# EasyEDA Pro project H7MS-native-wired-before-footprint-audit-20261017.epro

# Schematic H7MS_CORE_H735_A1_核心板原理图

## Sheets
1 C01A_H735主控与信号分配: Assembly Variant: Basic; Board Name: Board1; Create Date: 2026-08-30; Page Name: P1; Project Name: H7MS-Core-A1; Schematic Name: Schematic1; Update Date: 2026-08-30; Company: 嘉立创EDA; Page Size: A4; Version: V1.0
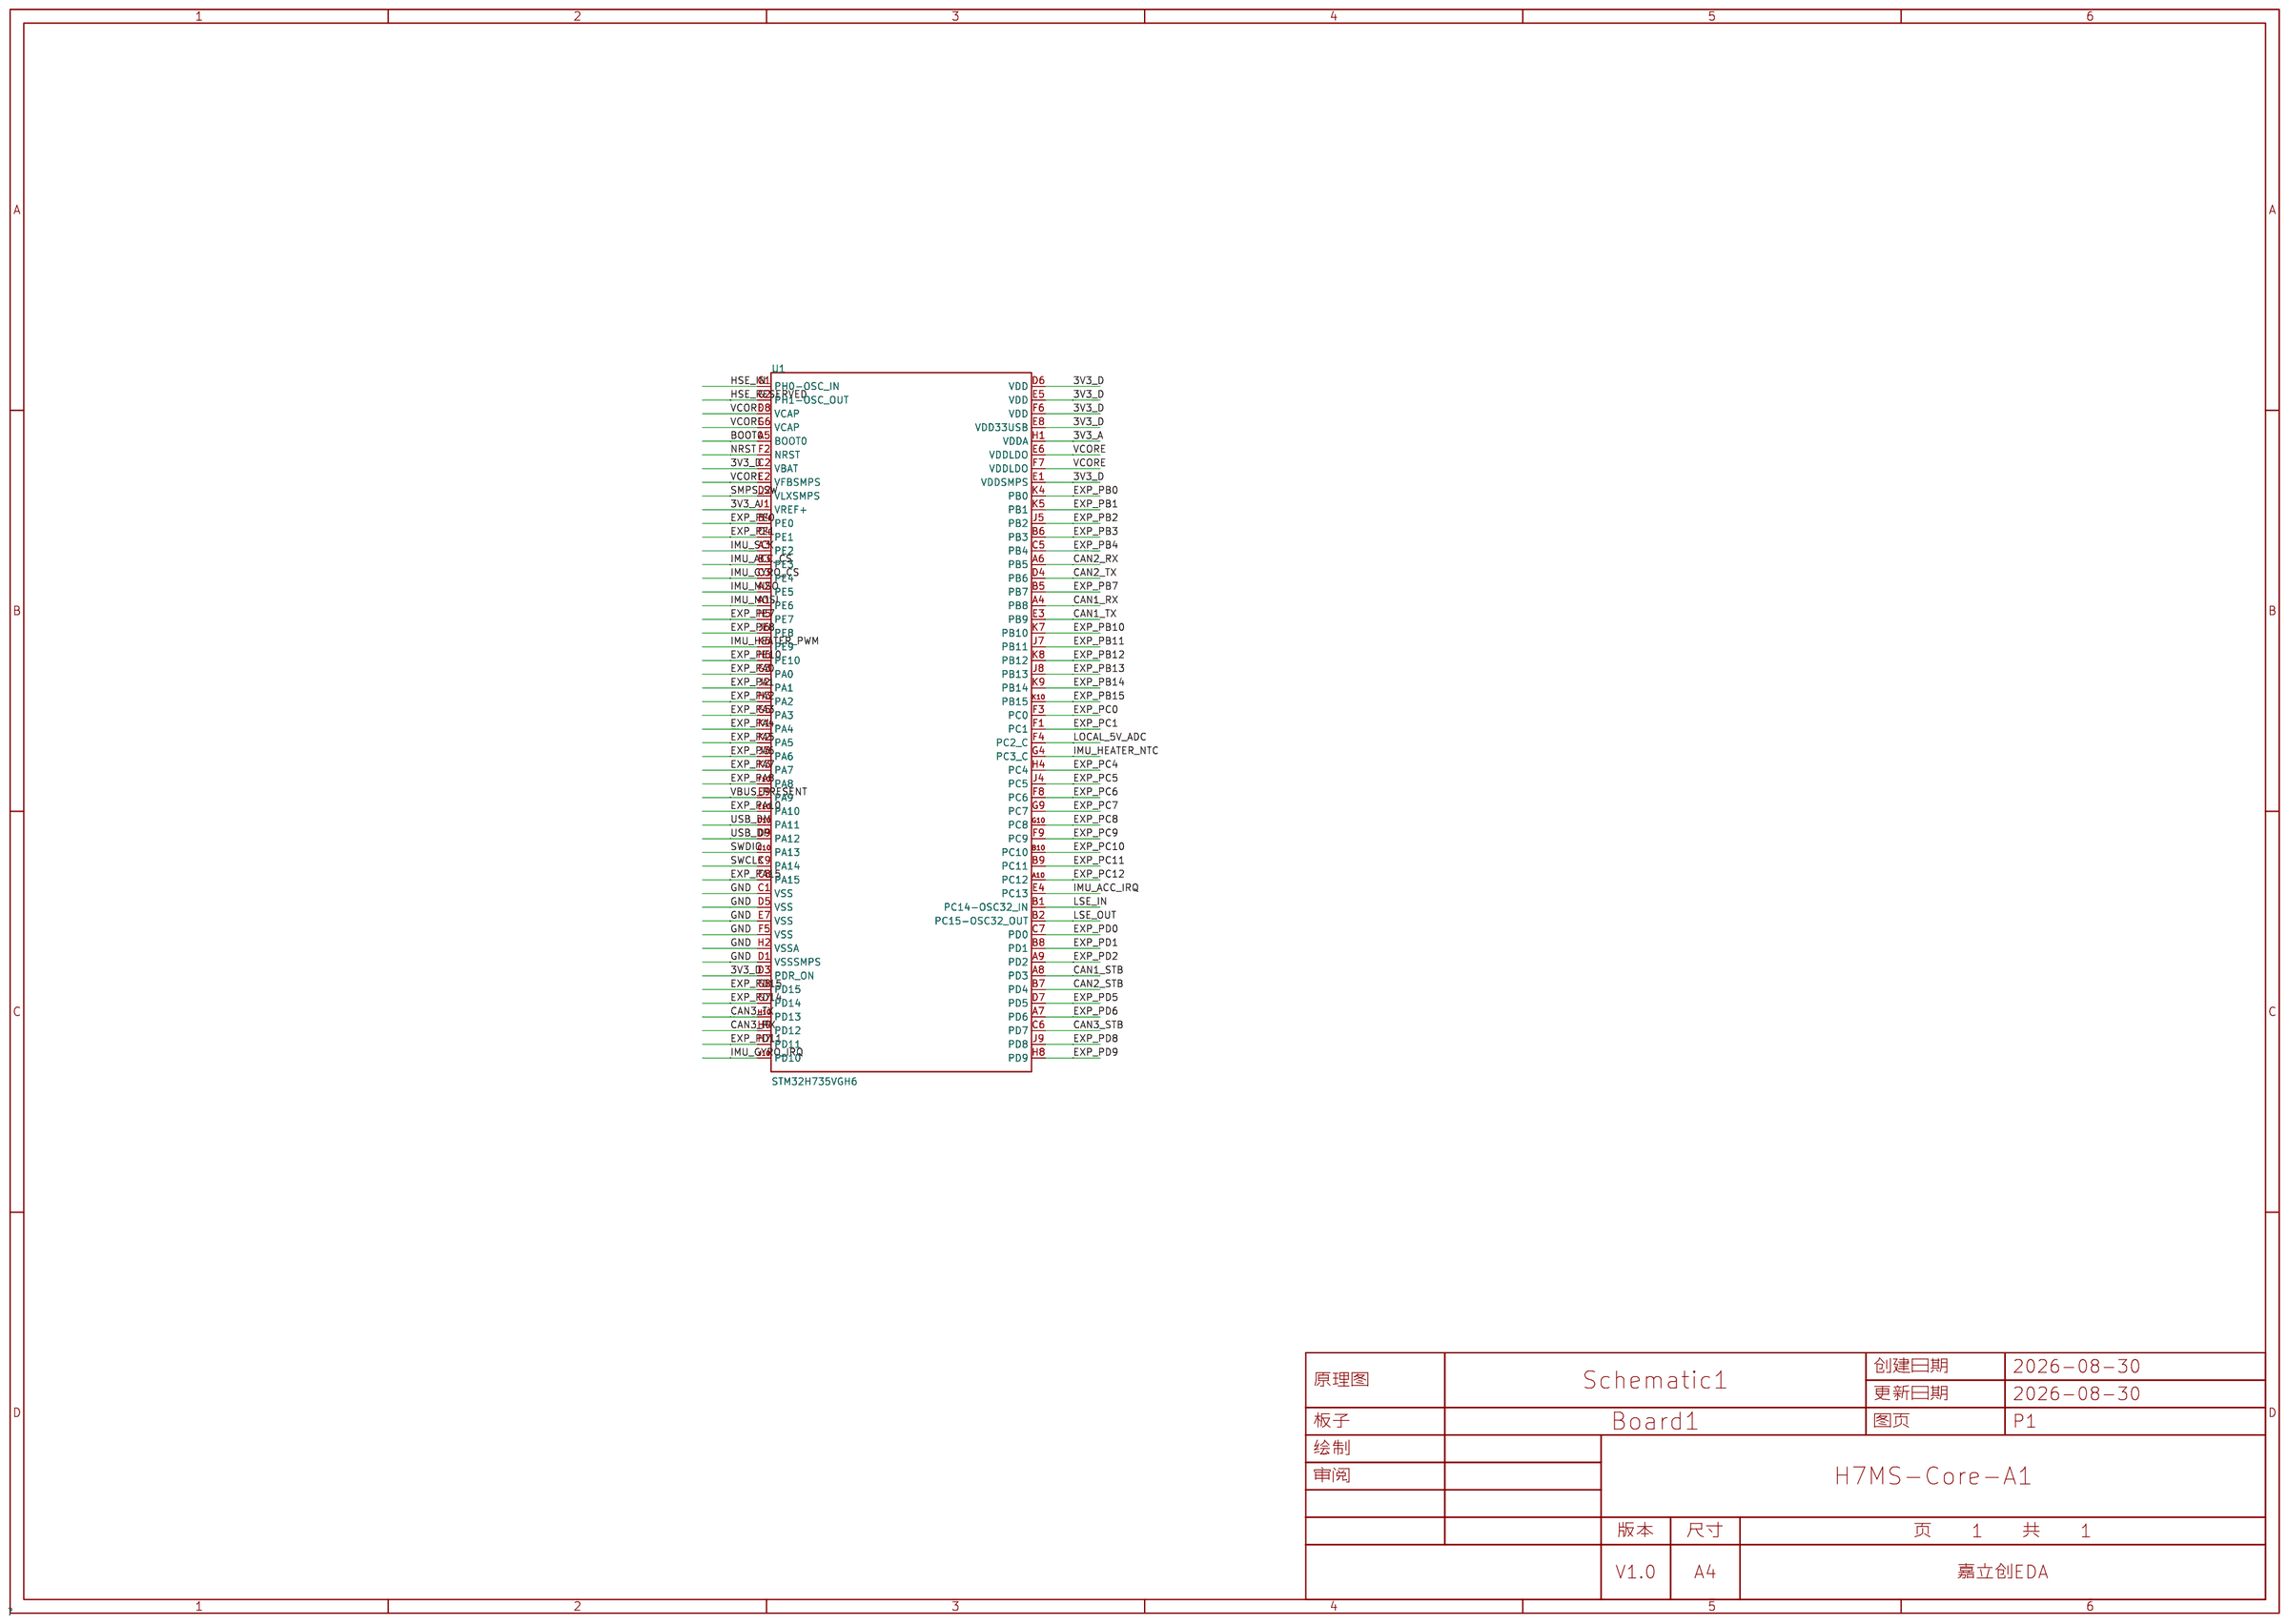
[diagram p0: C01A_H735主控与信号分配]
2 C01B_主控SMPS与电源去耦: Create Date: 2026-10-17; Update Date: 2026-10-17
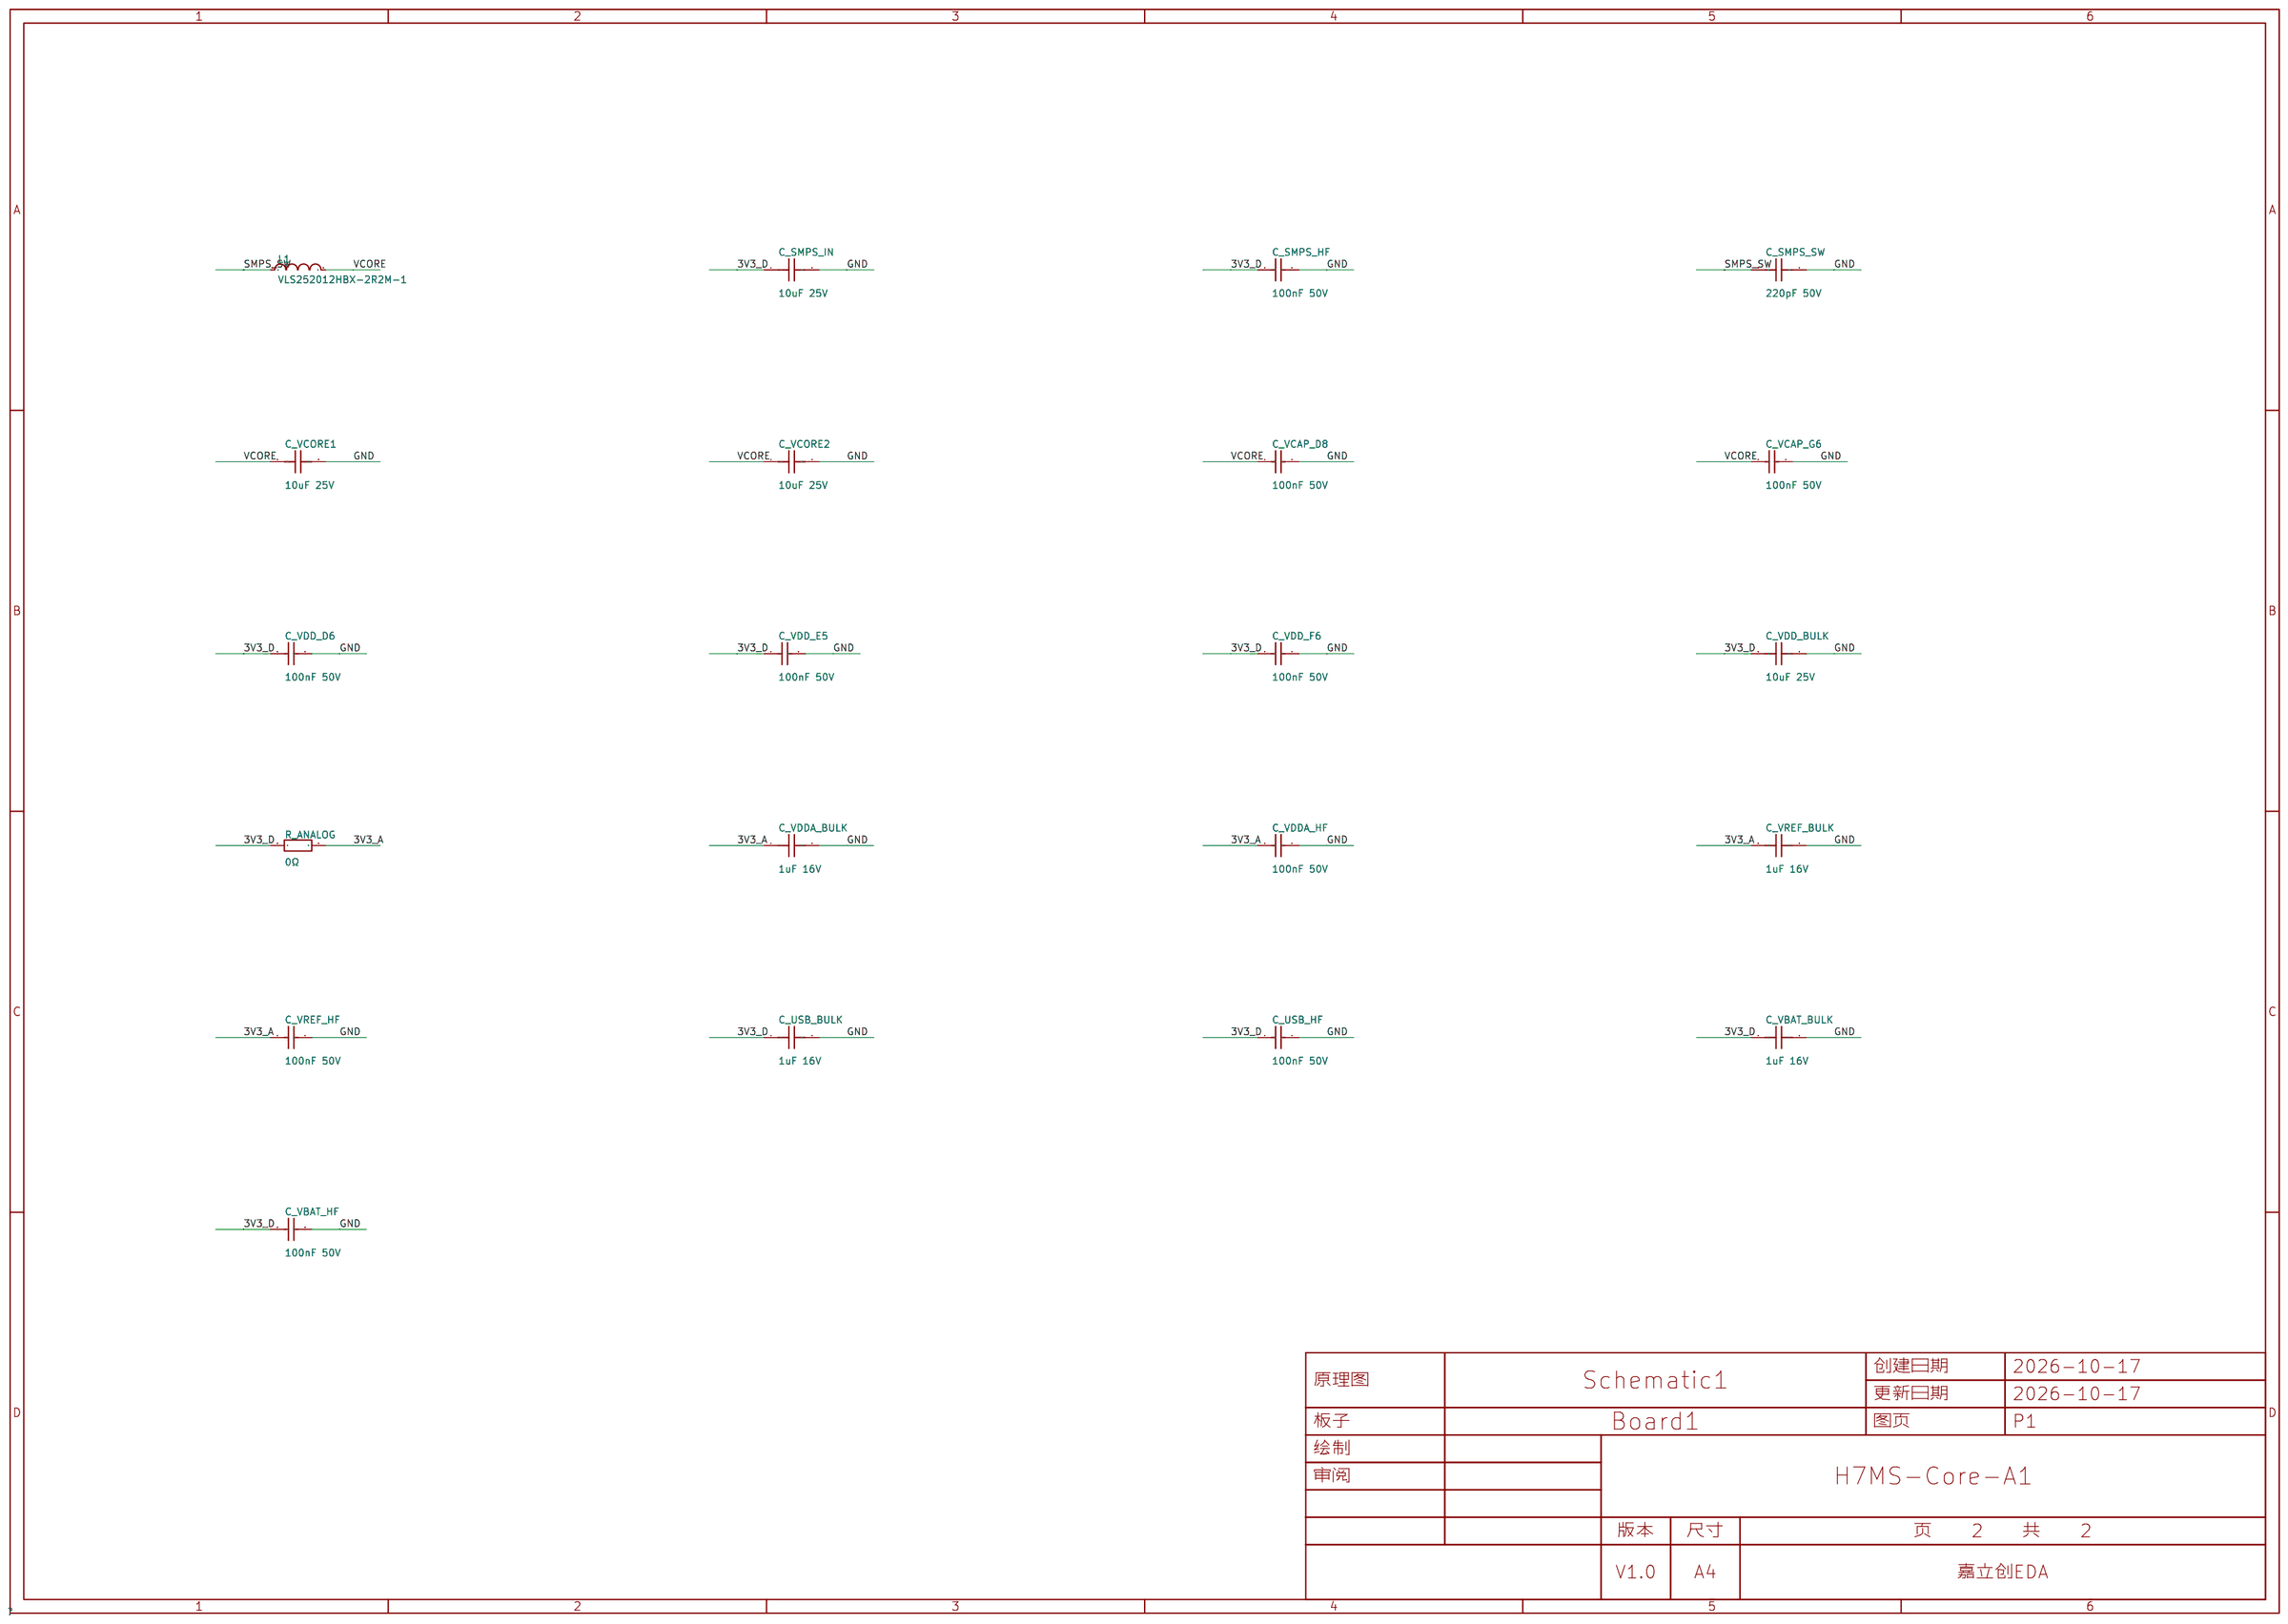
[diagram p1: C01B_主控SMPS与电源去耦]
3 C02_3V3降压与扩展电源保护: Create Date: 2026-10-17; Update Date: 2026-10-17
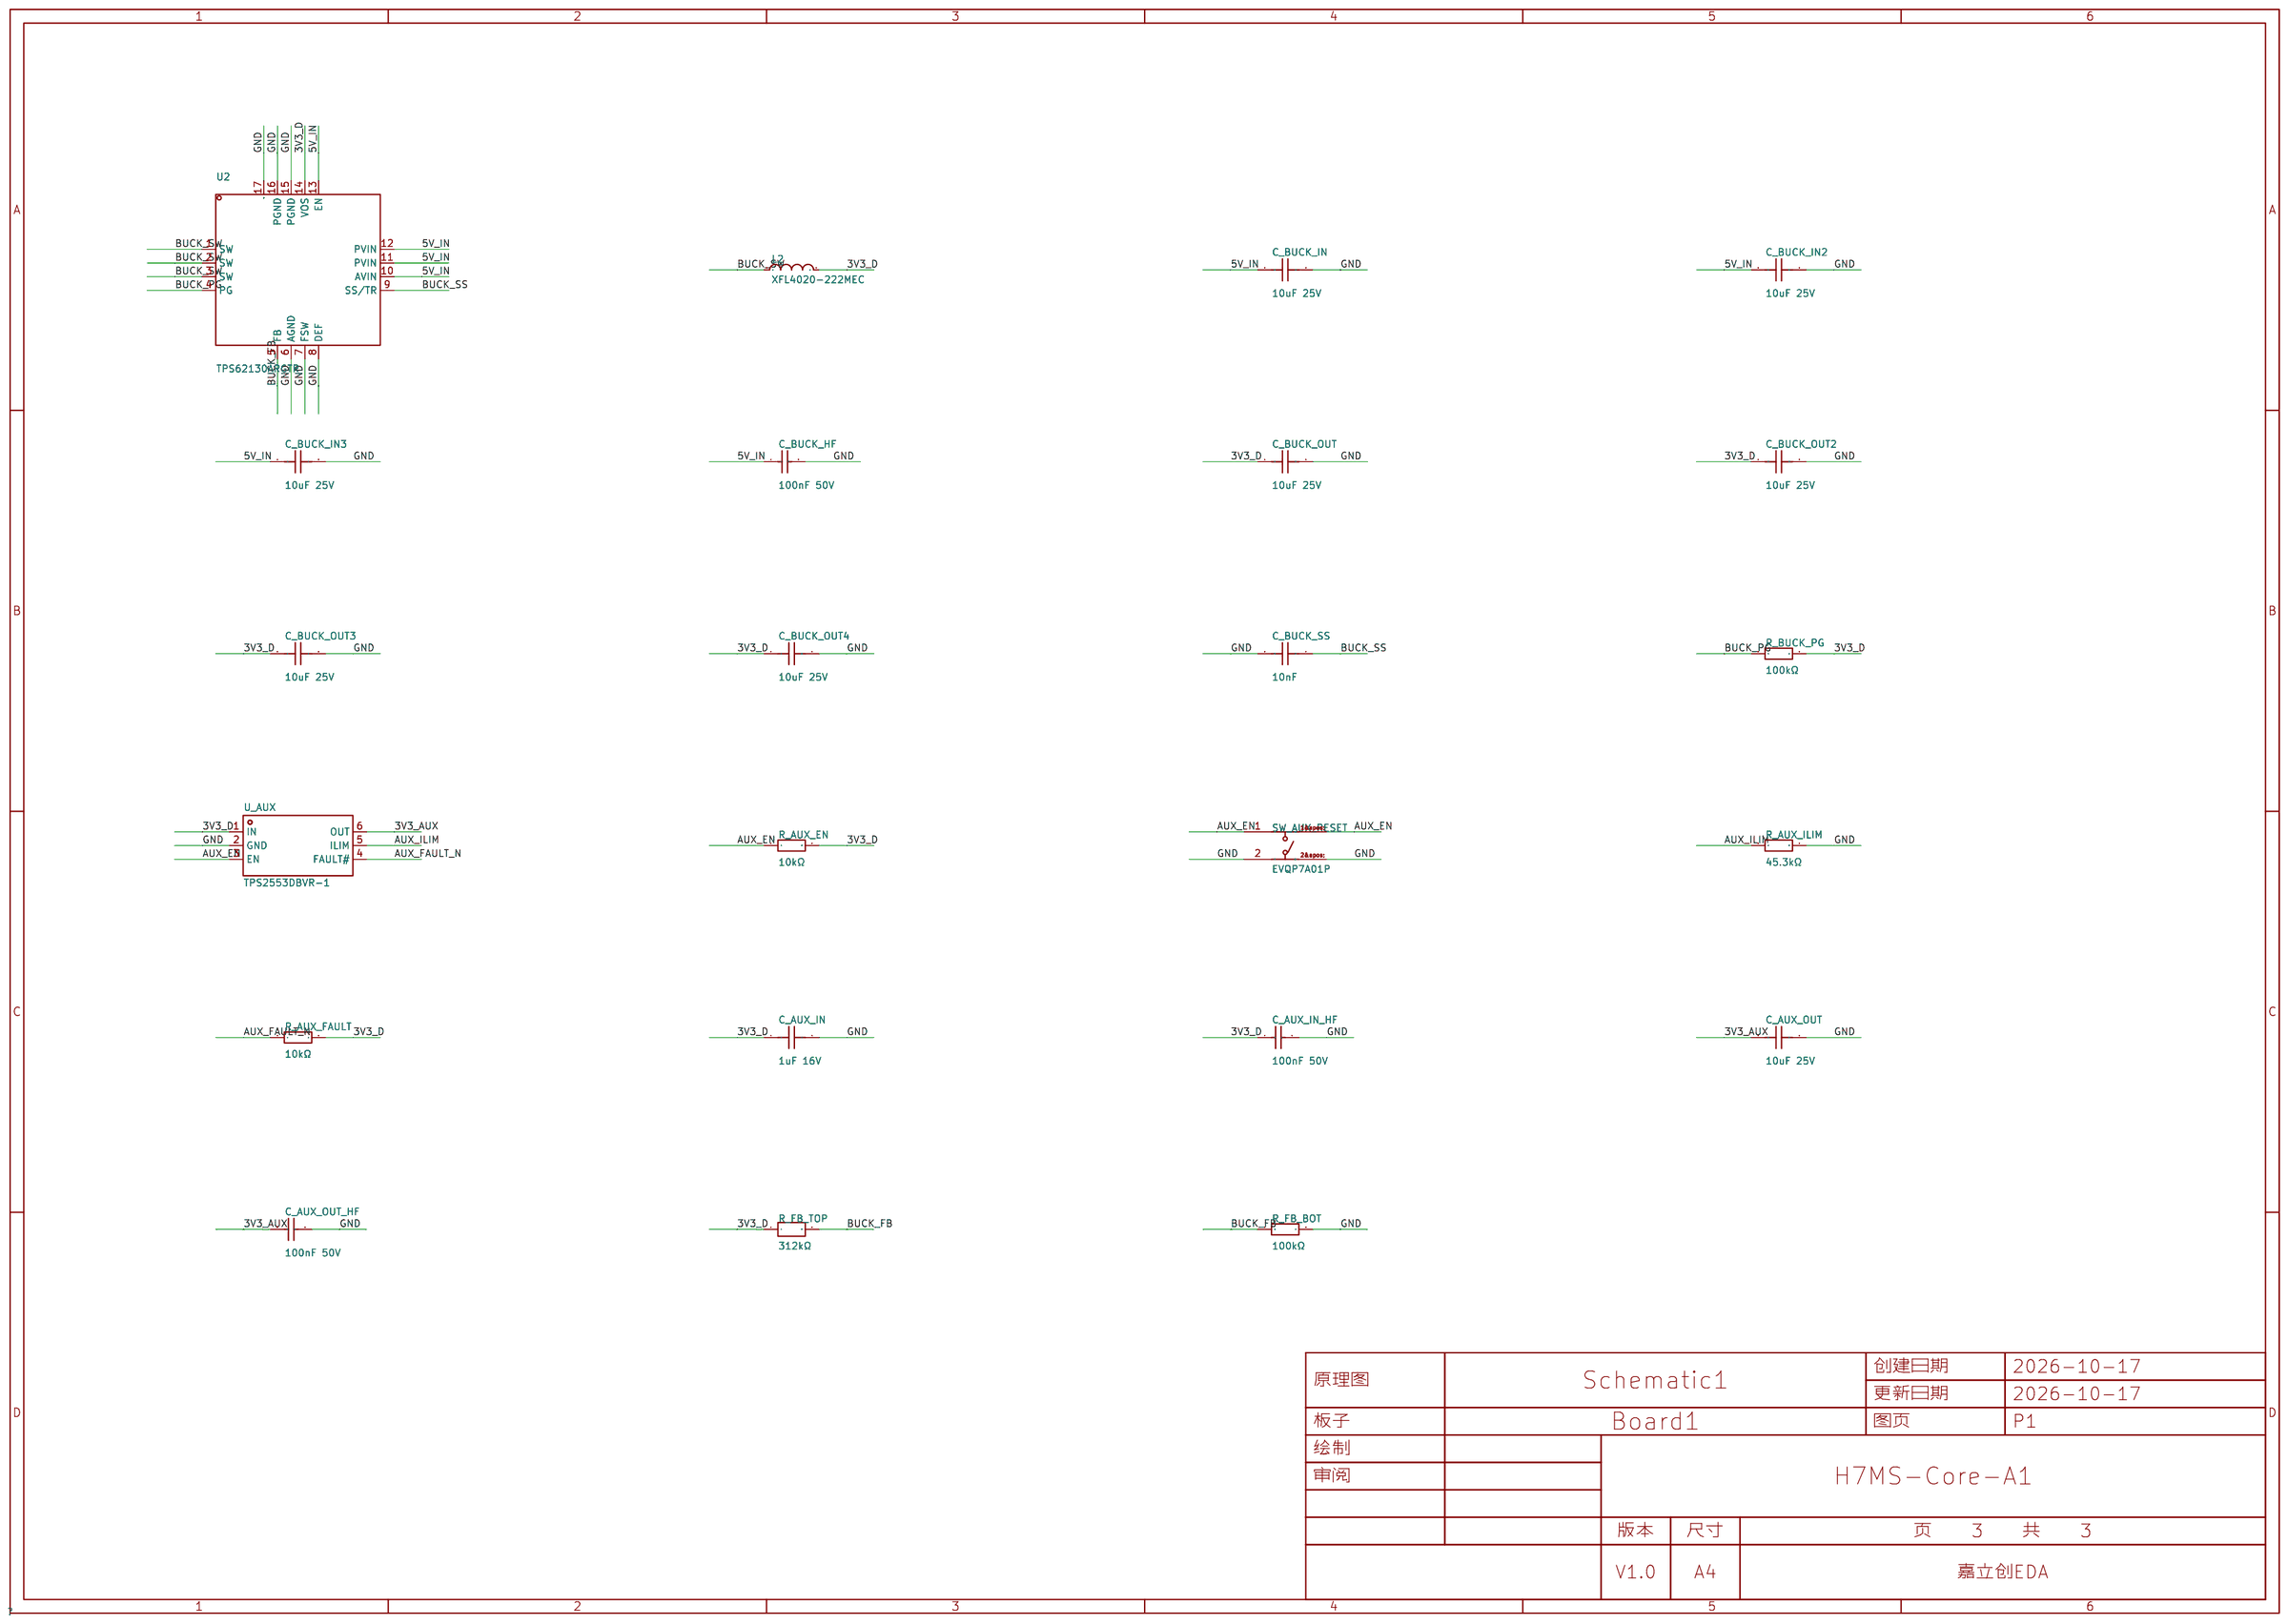
[diagram p2: C02_3V3降压与扩展电源保护]
4 C03_时钟复位启动与SWD: Create Date: 2026-10-17; Update Date: 2026-10-17
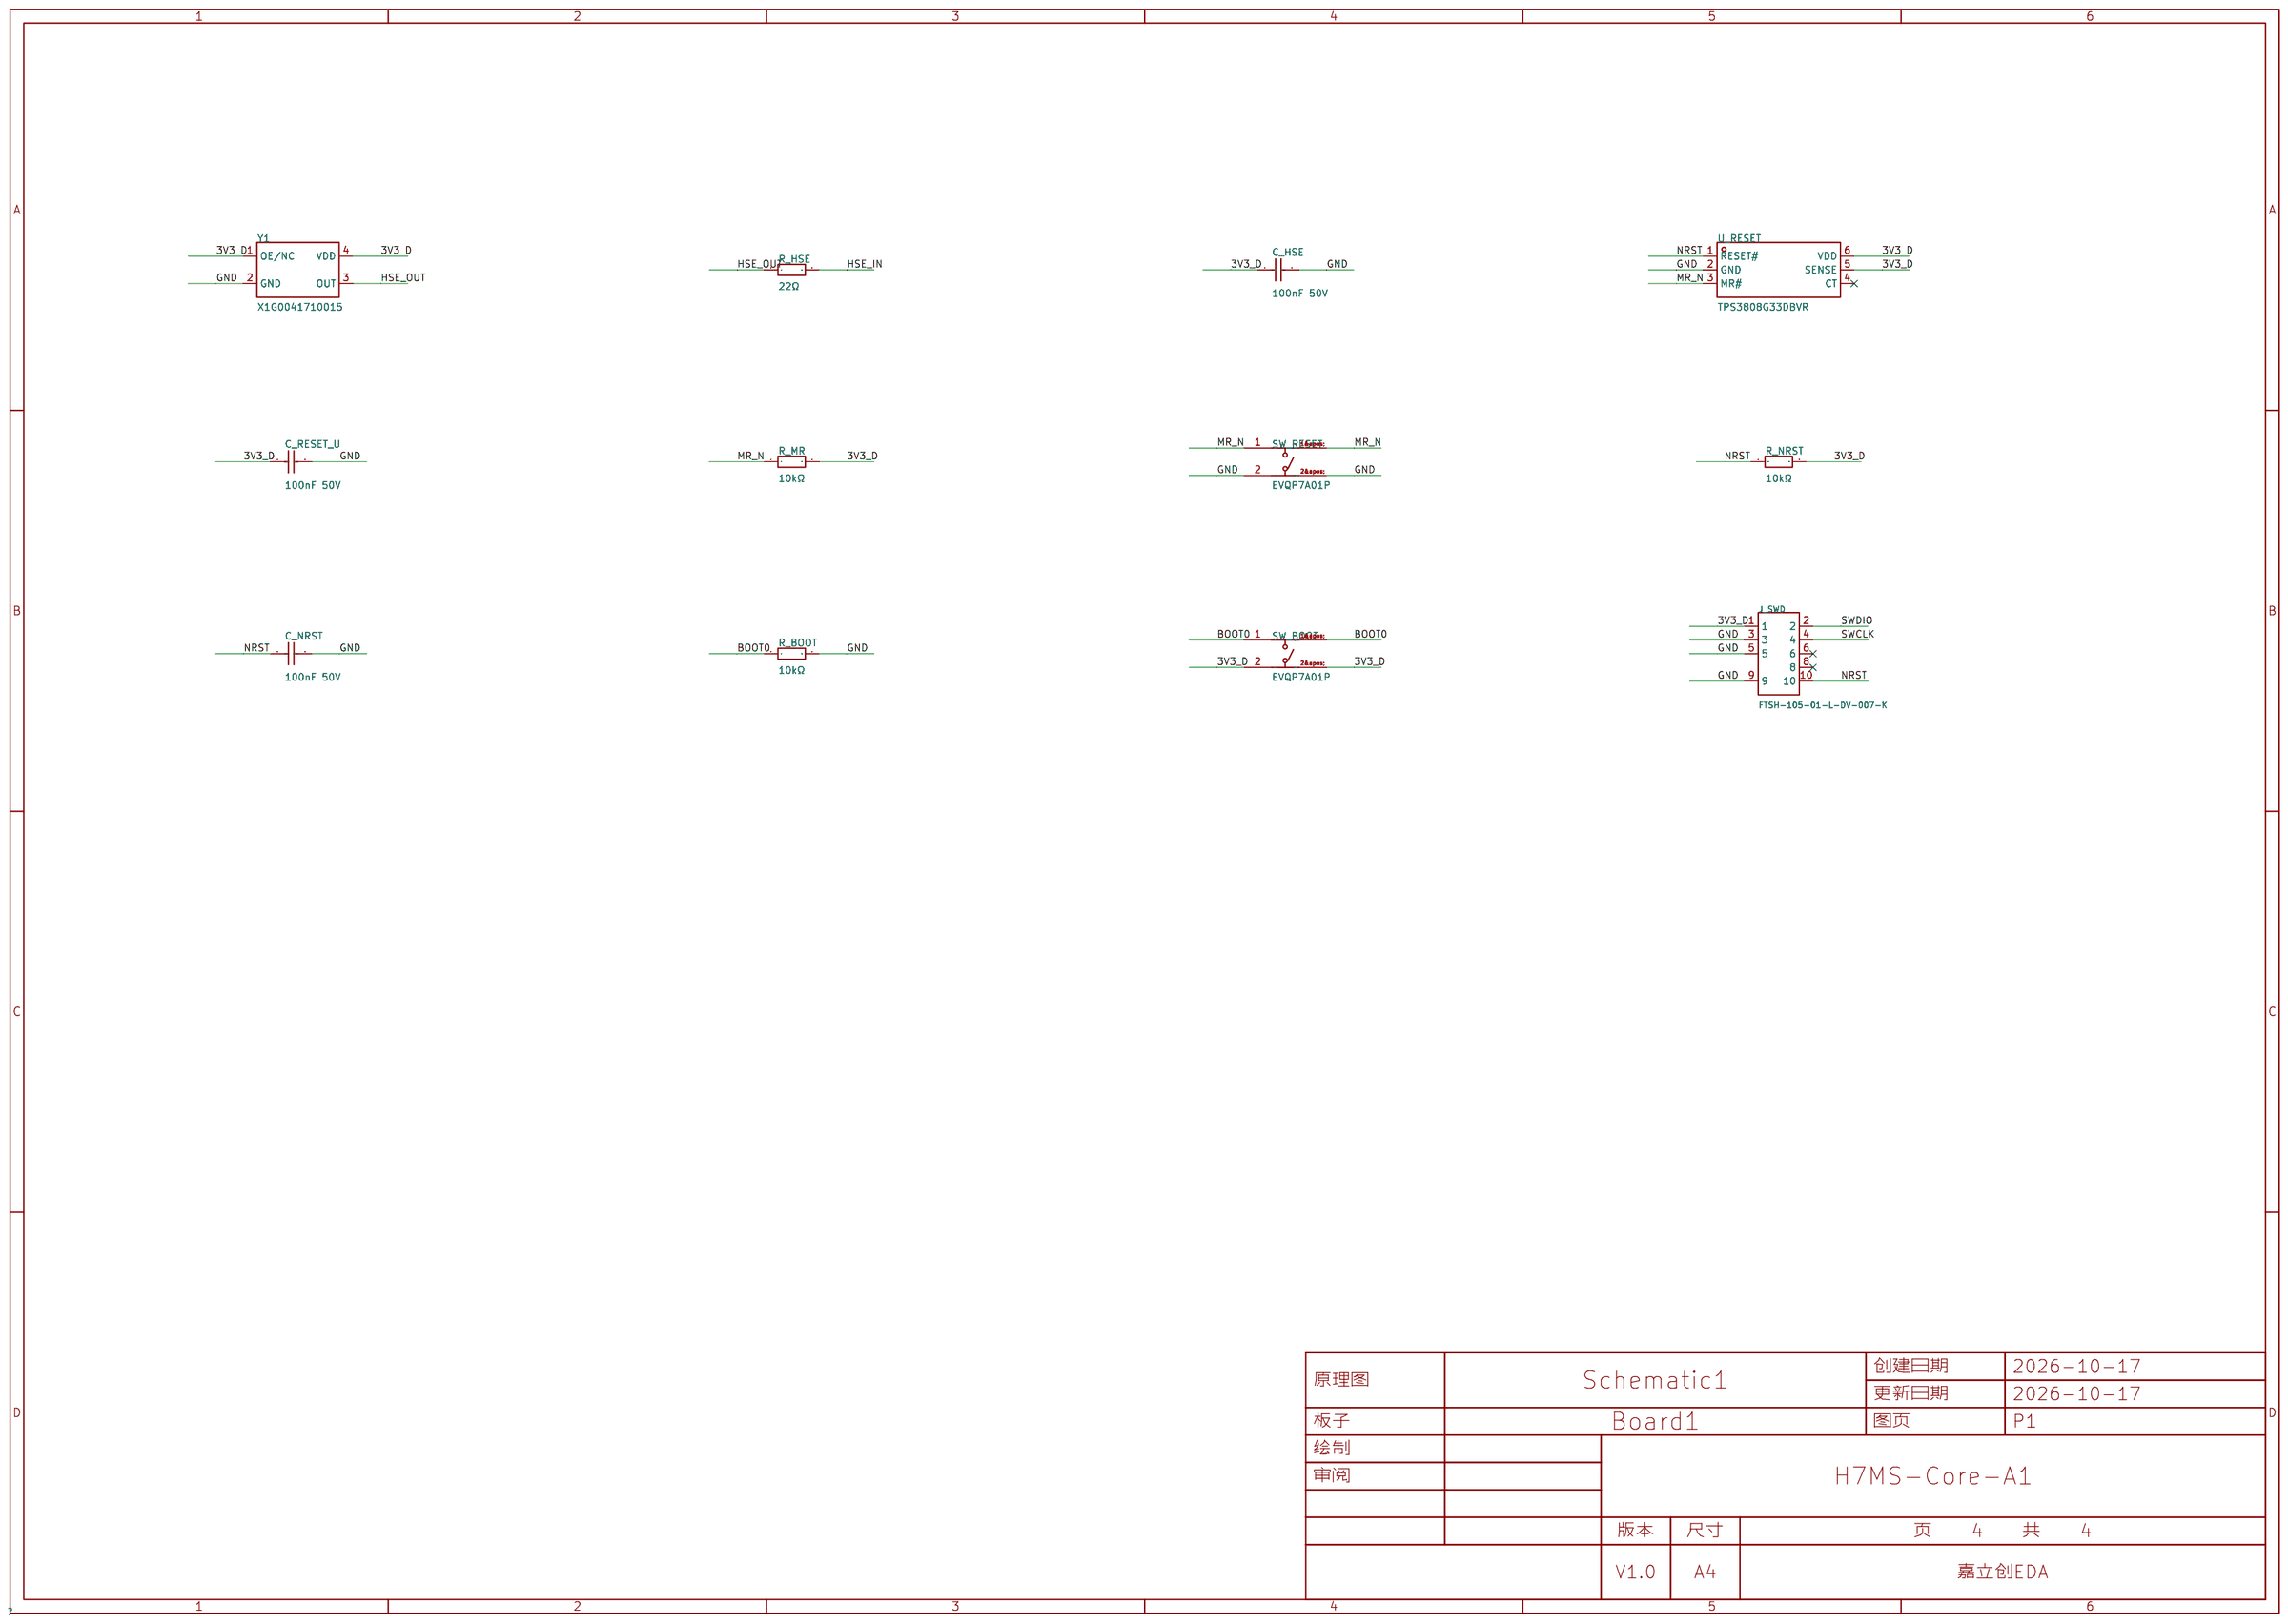
[diagram p3: C03_时钟复位启动与SWD]
5 C04_BMI088与加热安全控制: Create Date: 2026-10-17; Update Date: 2026-10-17
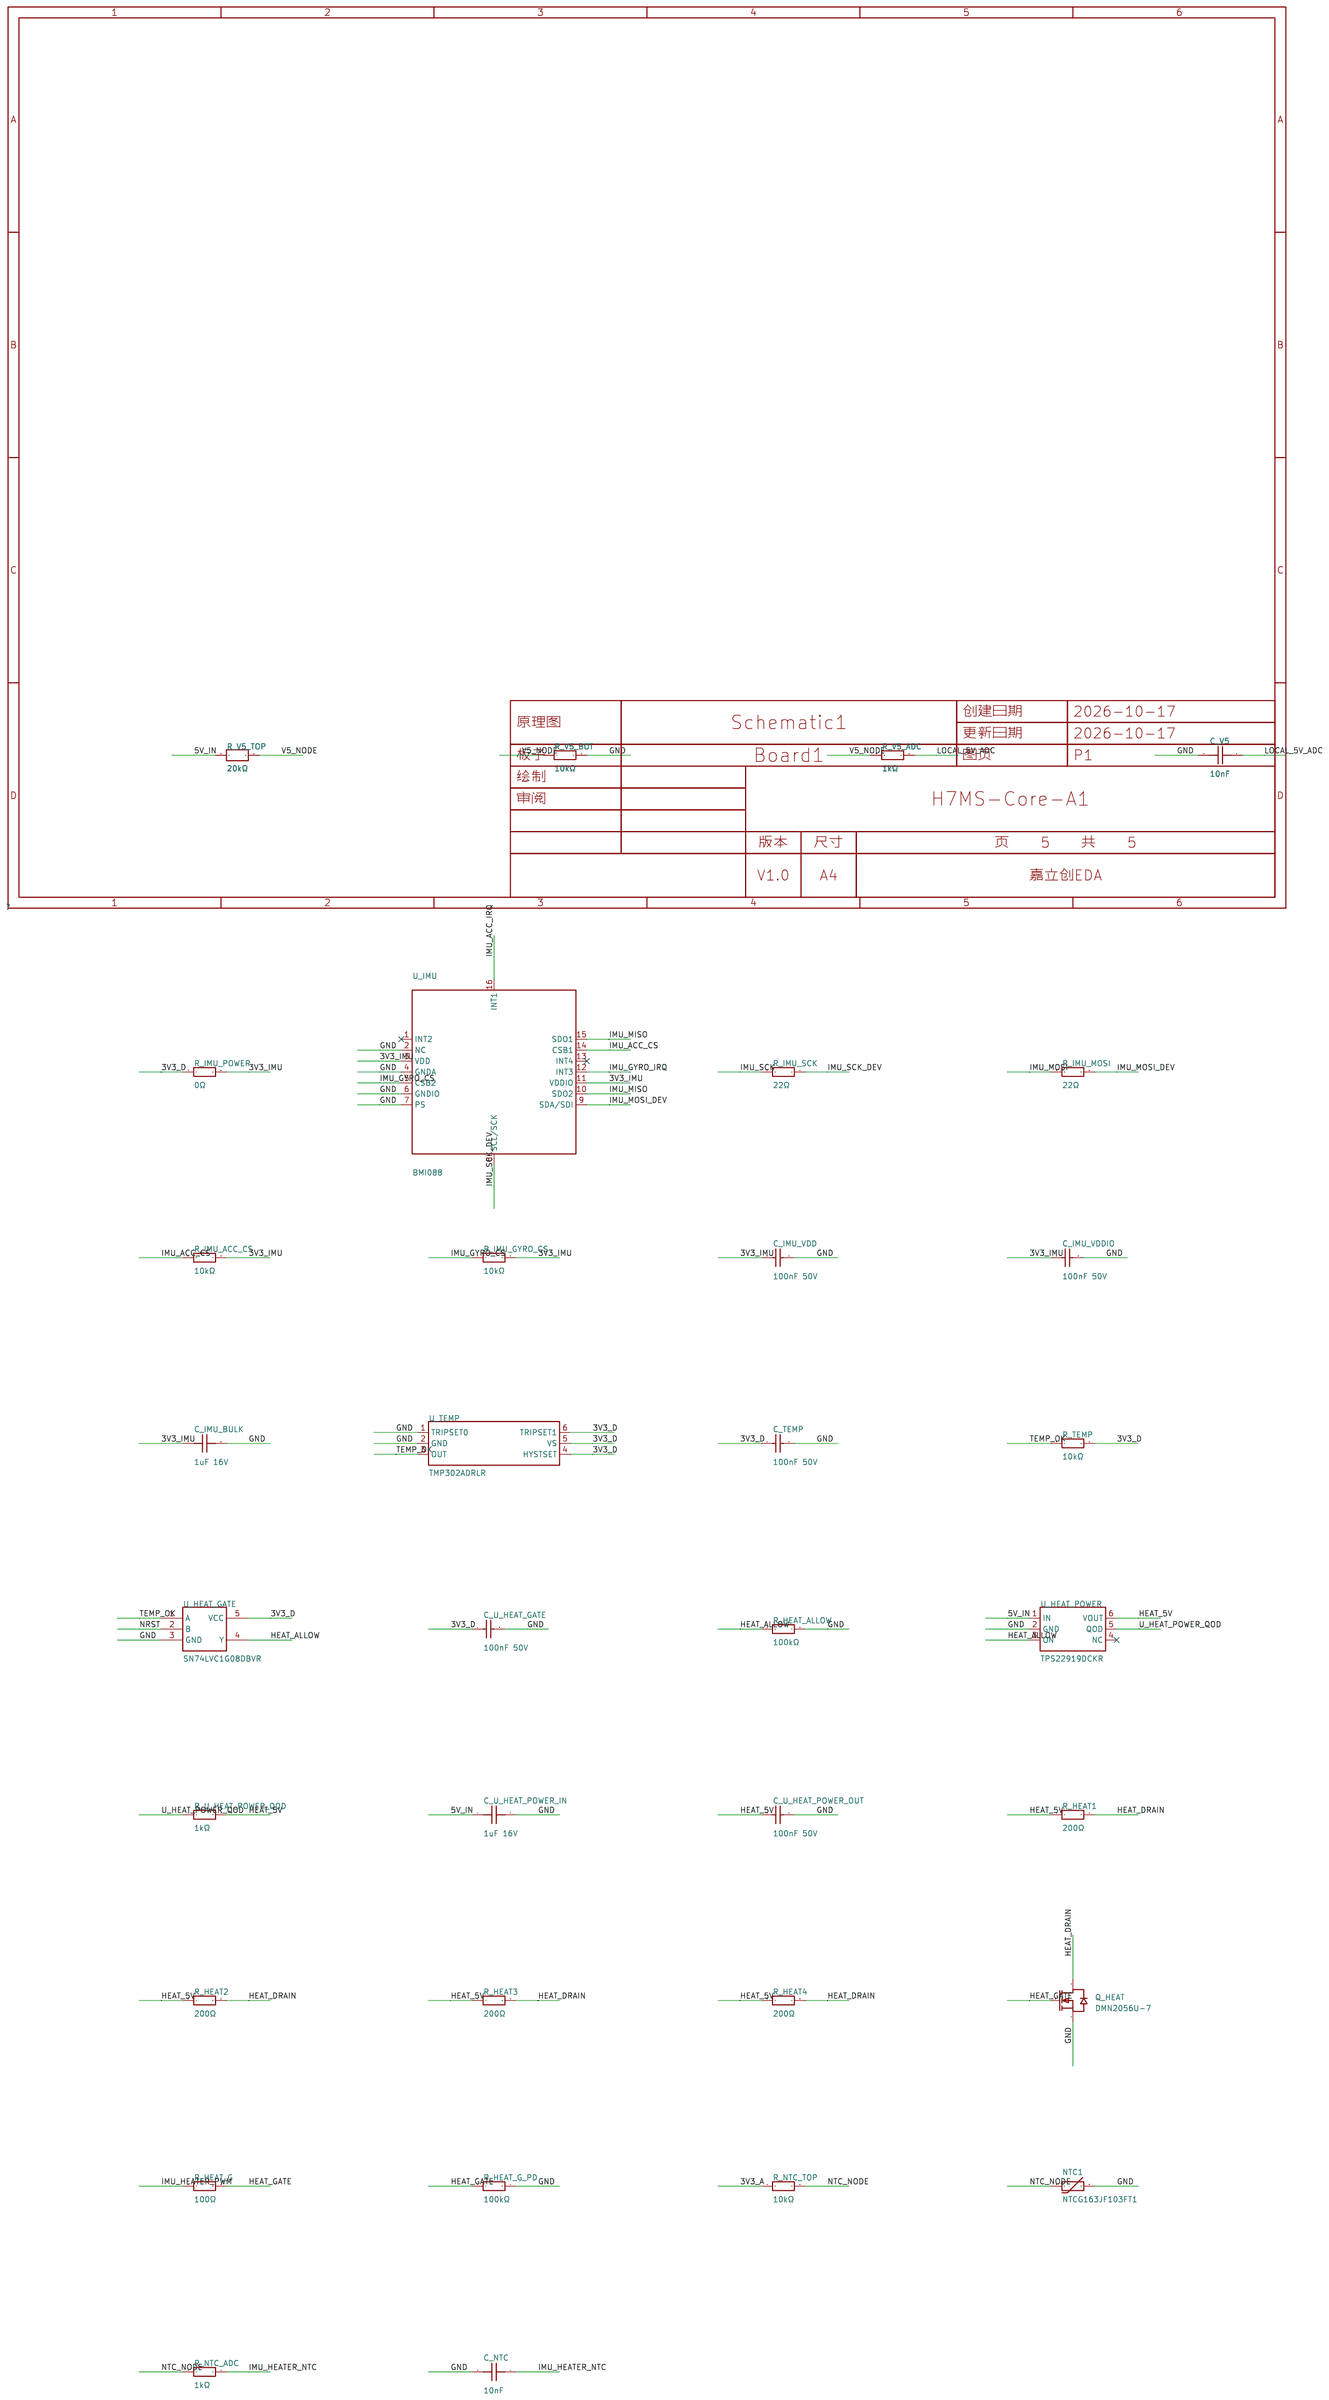
[diagram p4: C04_BMI088与加热安全控制]
6 C05_CAN三路收发与保护: Create Date: 2026-10-17; Update Date: 2026-10-17
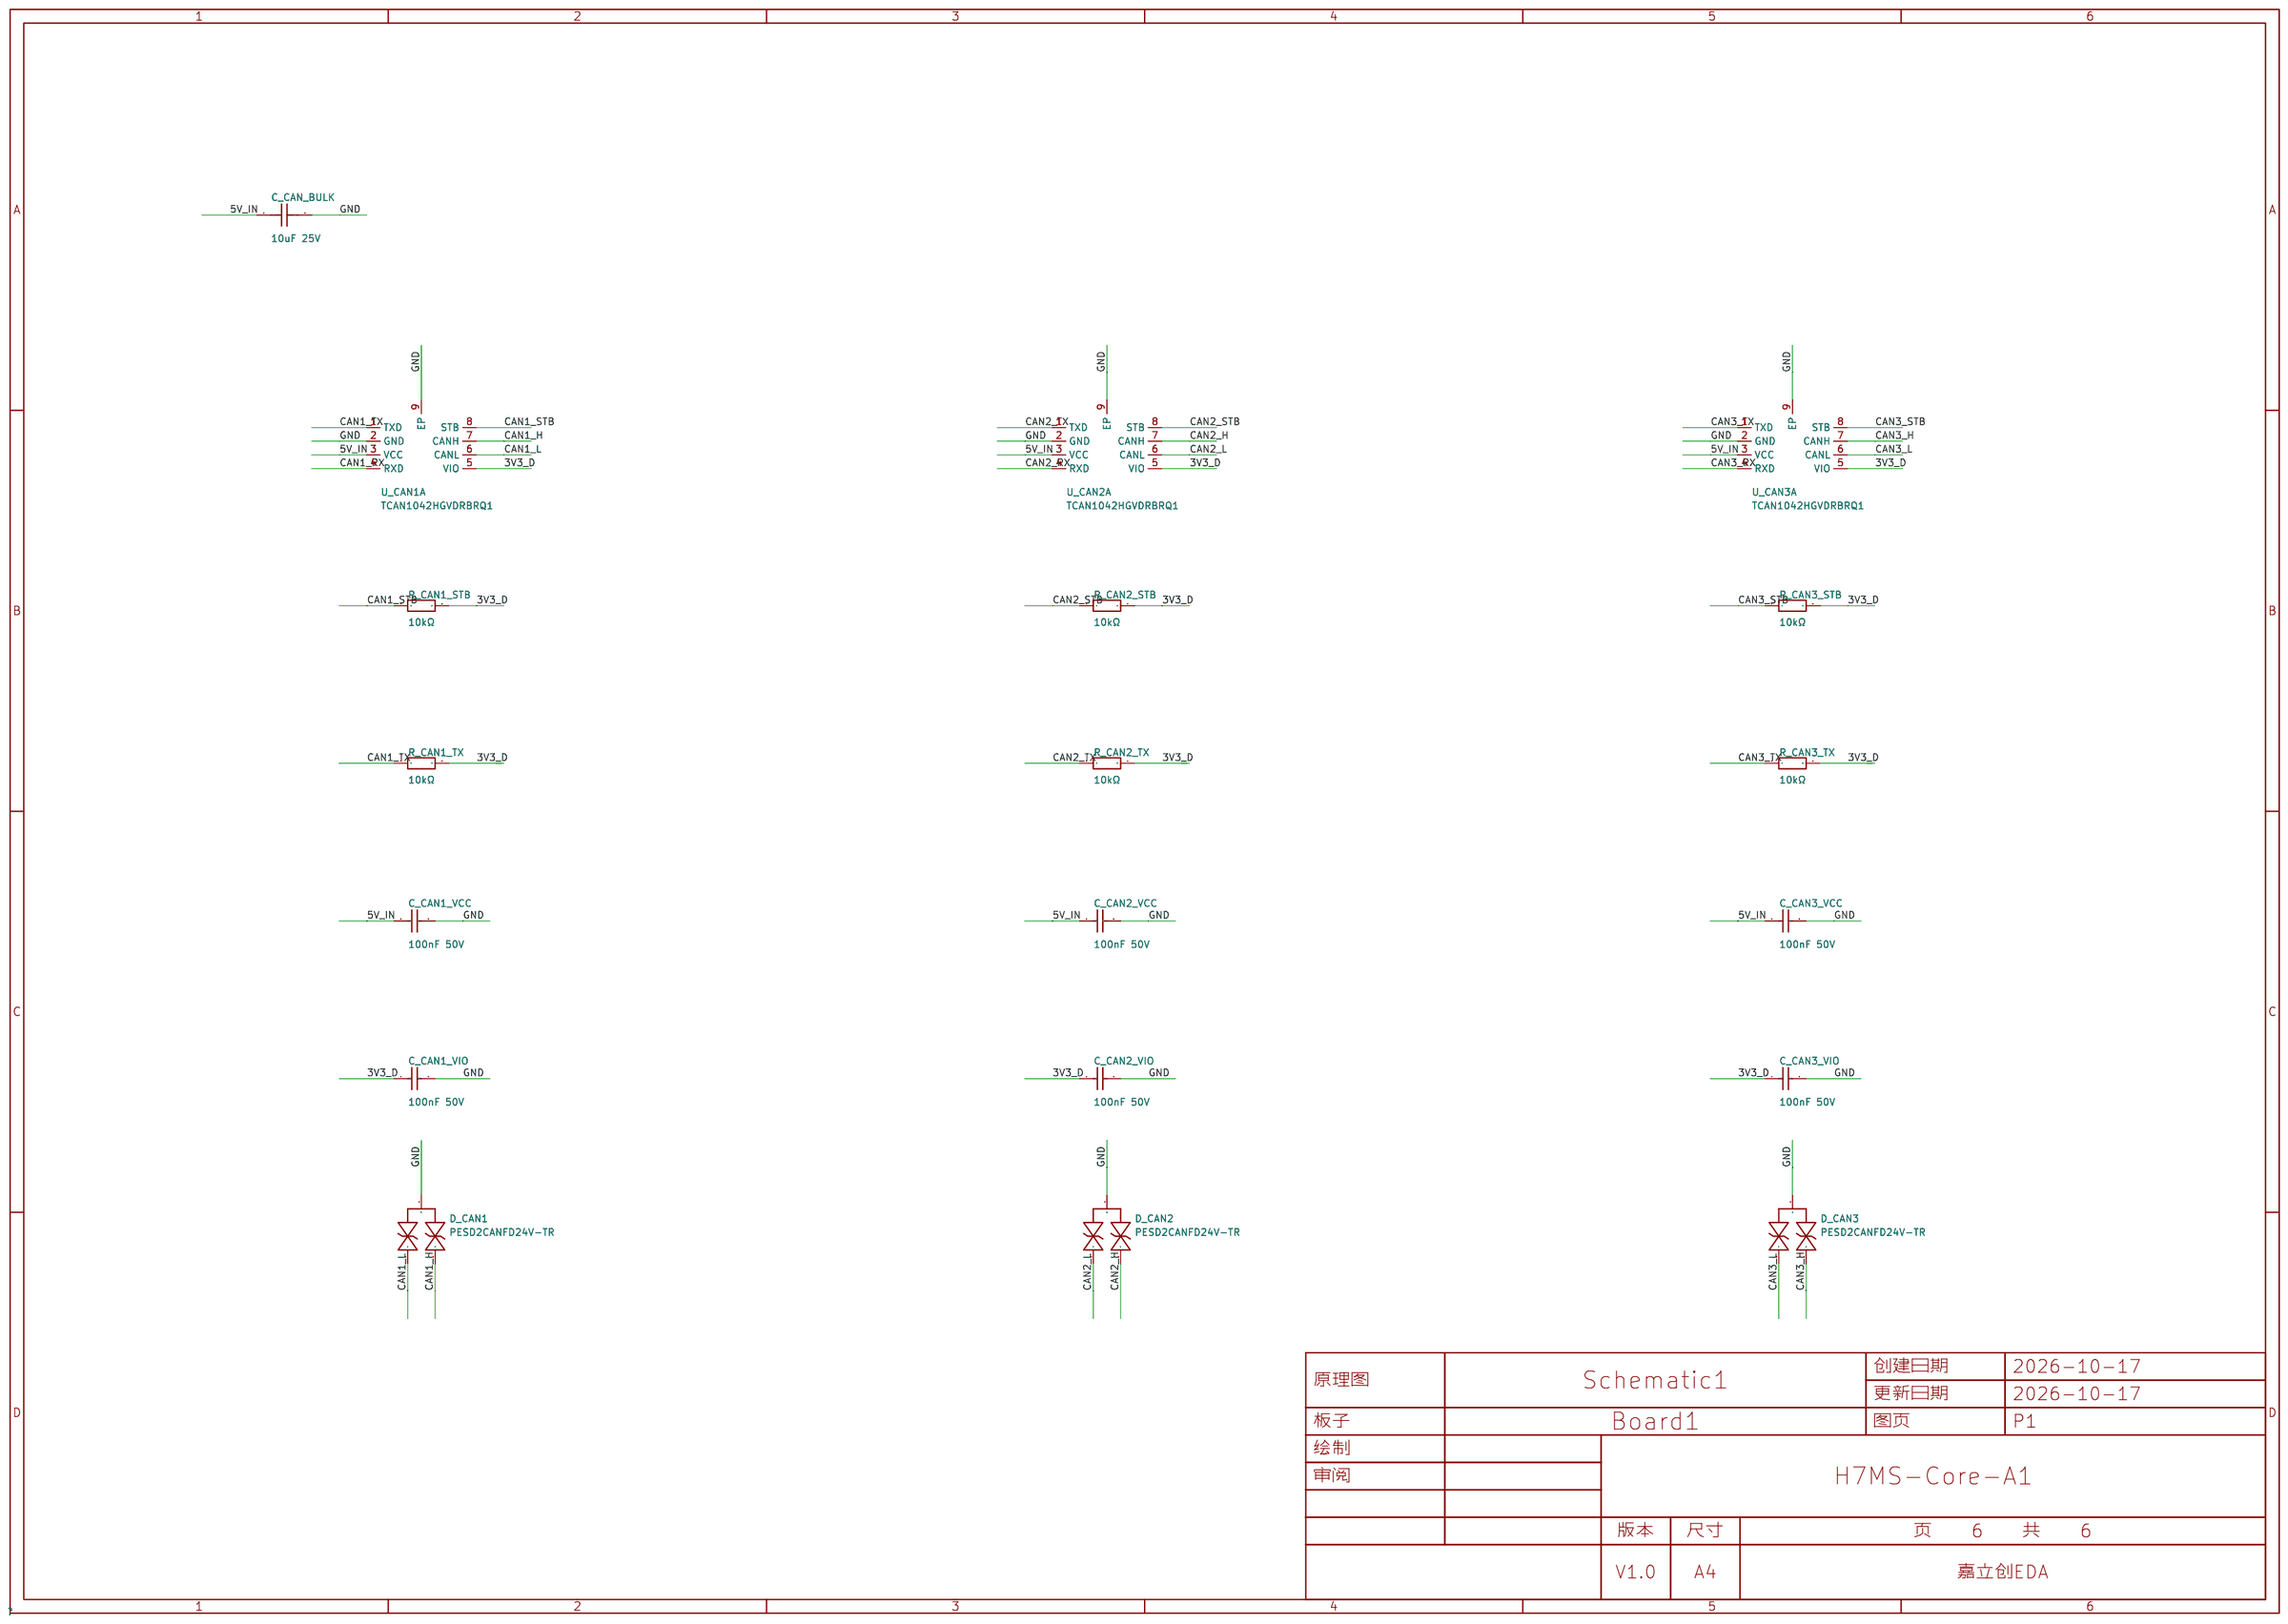
[diagram p5: C05_CAN三路收发与保护]
7 C06_USB设备接口与VBUS检测: Create Date: 2026-10-17; Update Date: 2026-10-17
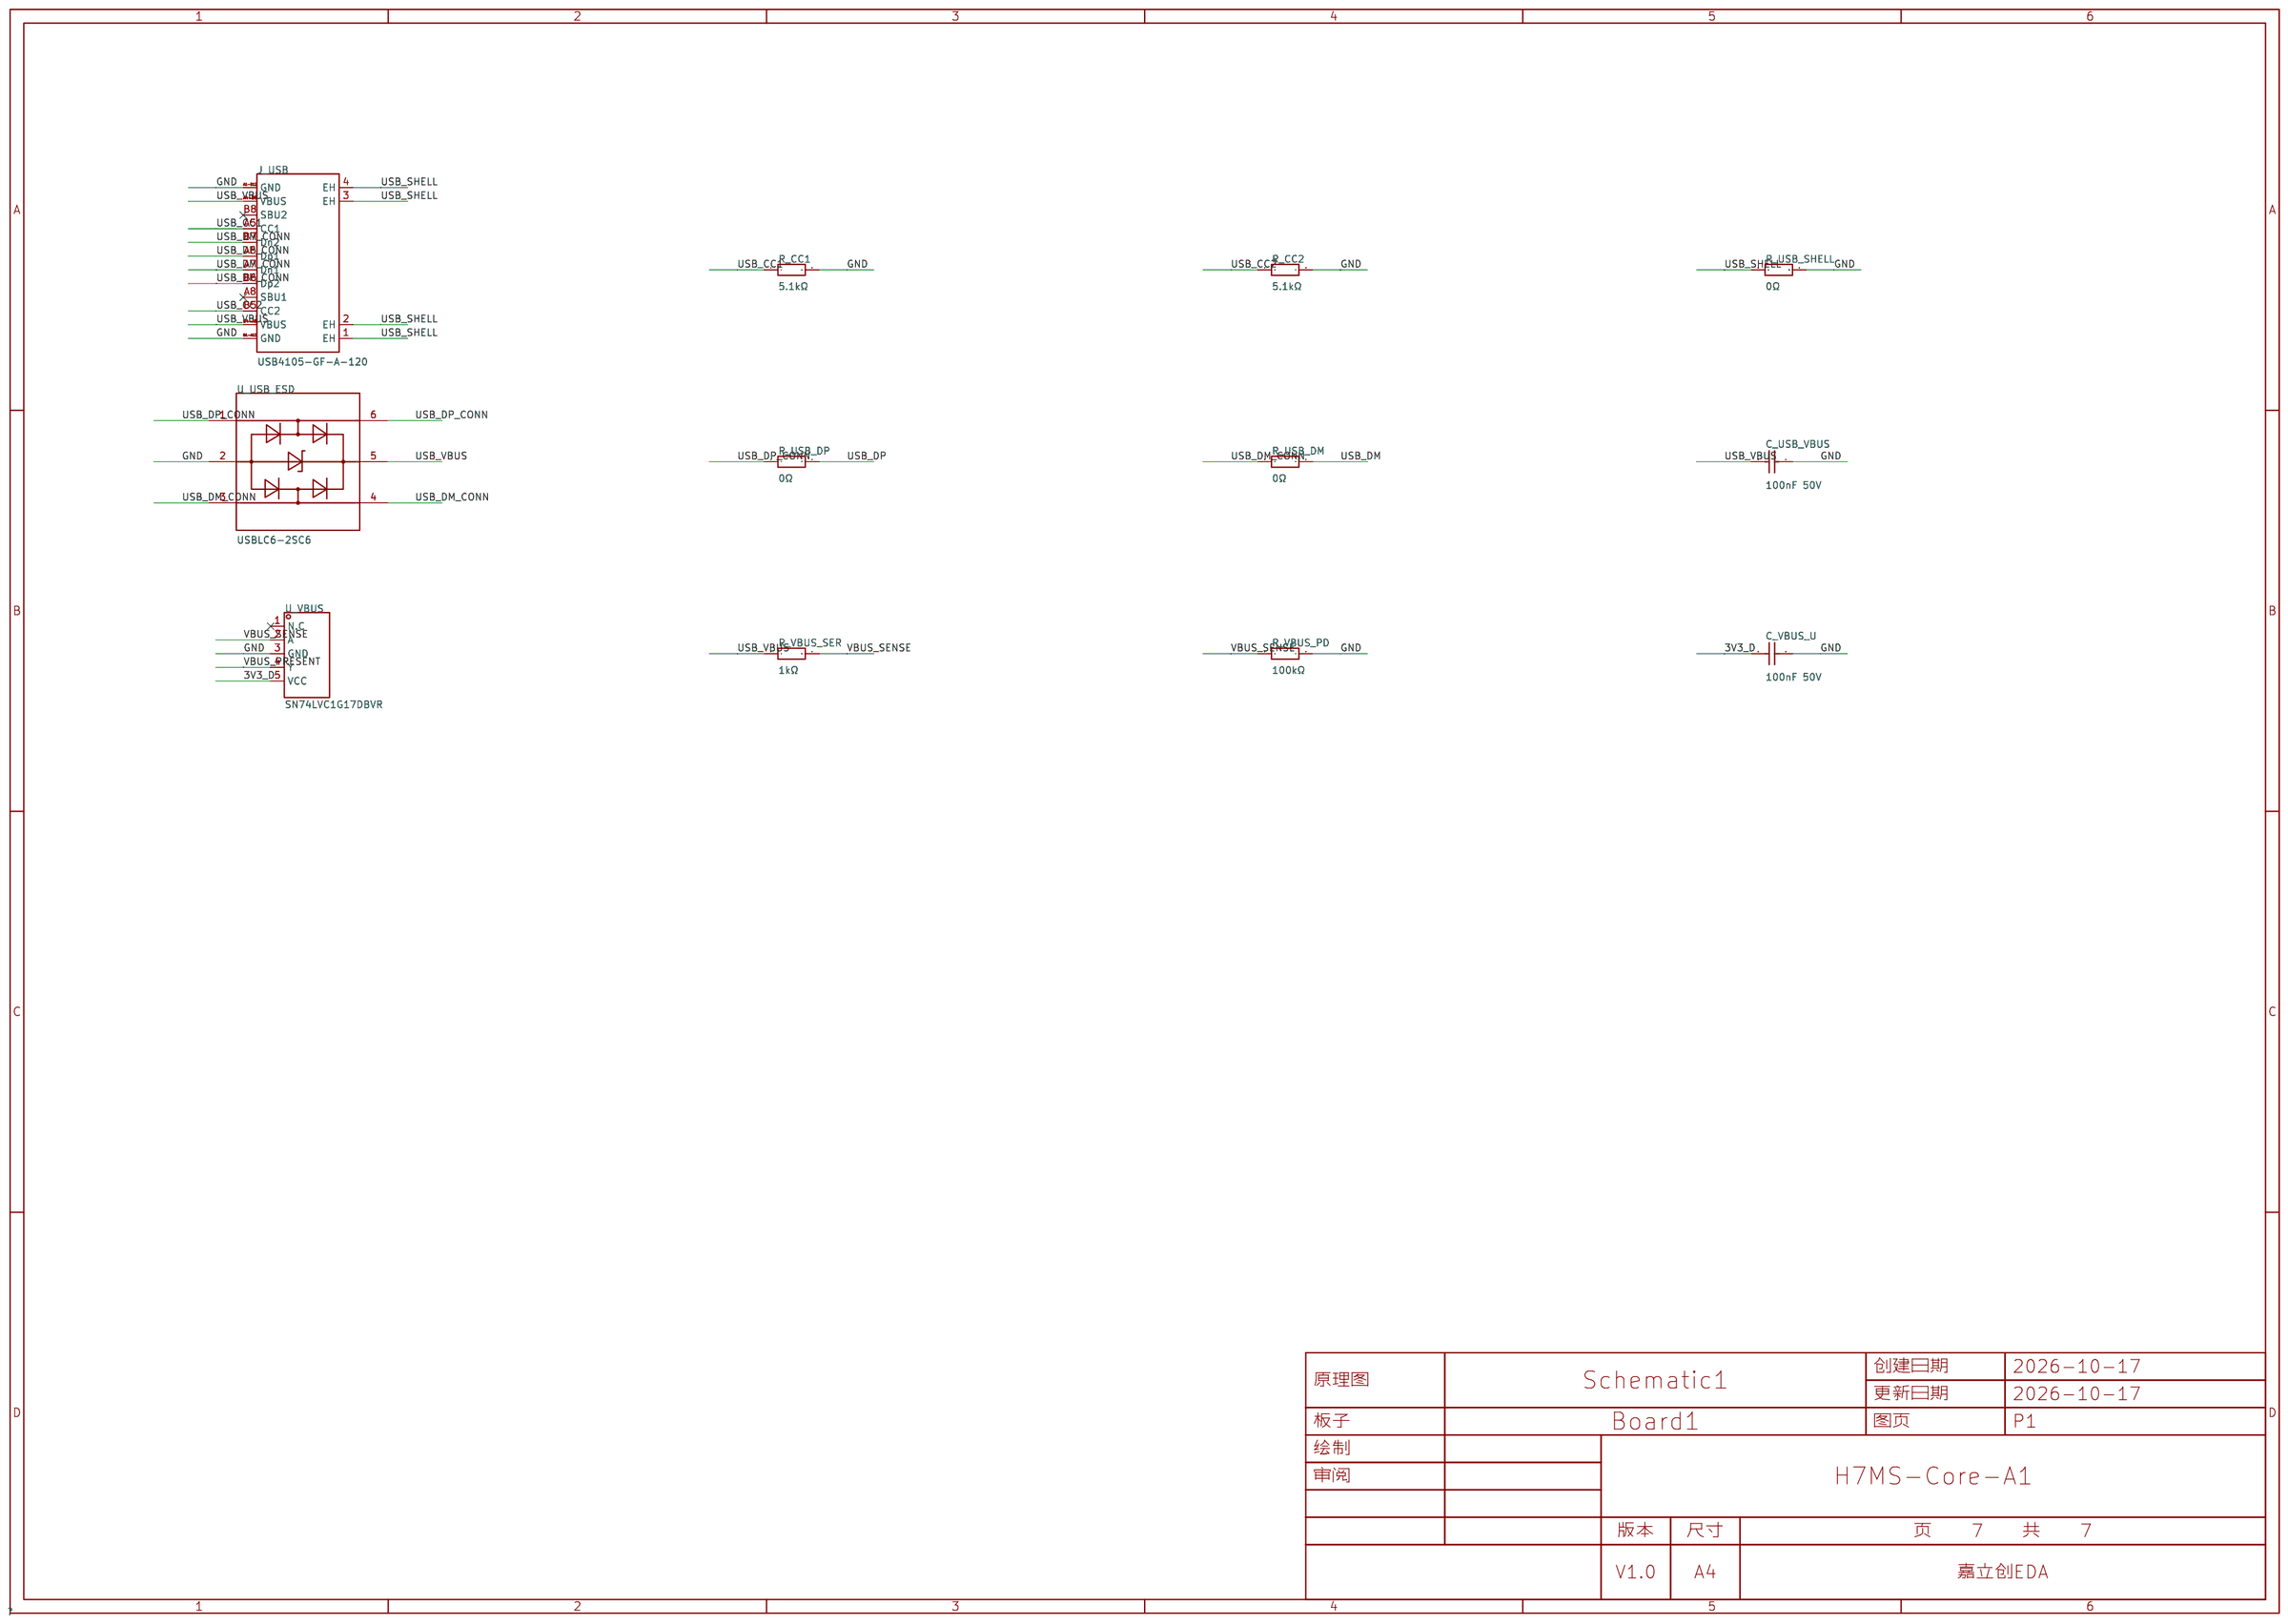
[diagram p6: C06_USB设备接口与VBUS检测]
8 C07_板间连接器与测试点: Create Date: 2026-10-17; Update Date: 2026-10-17
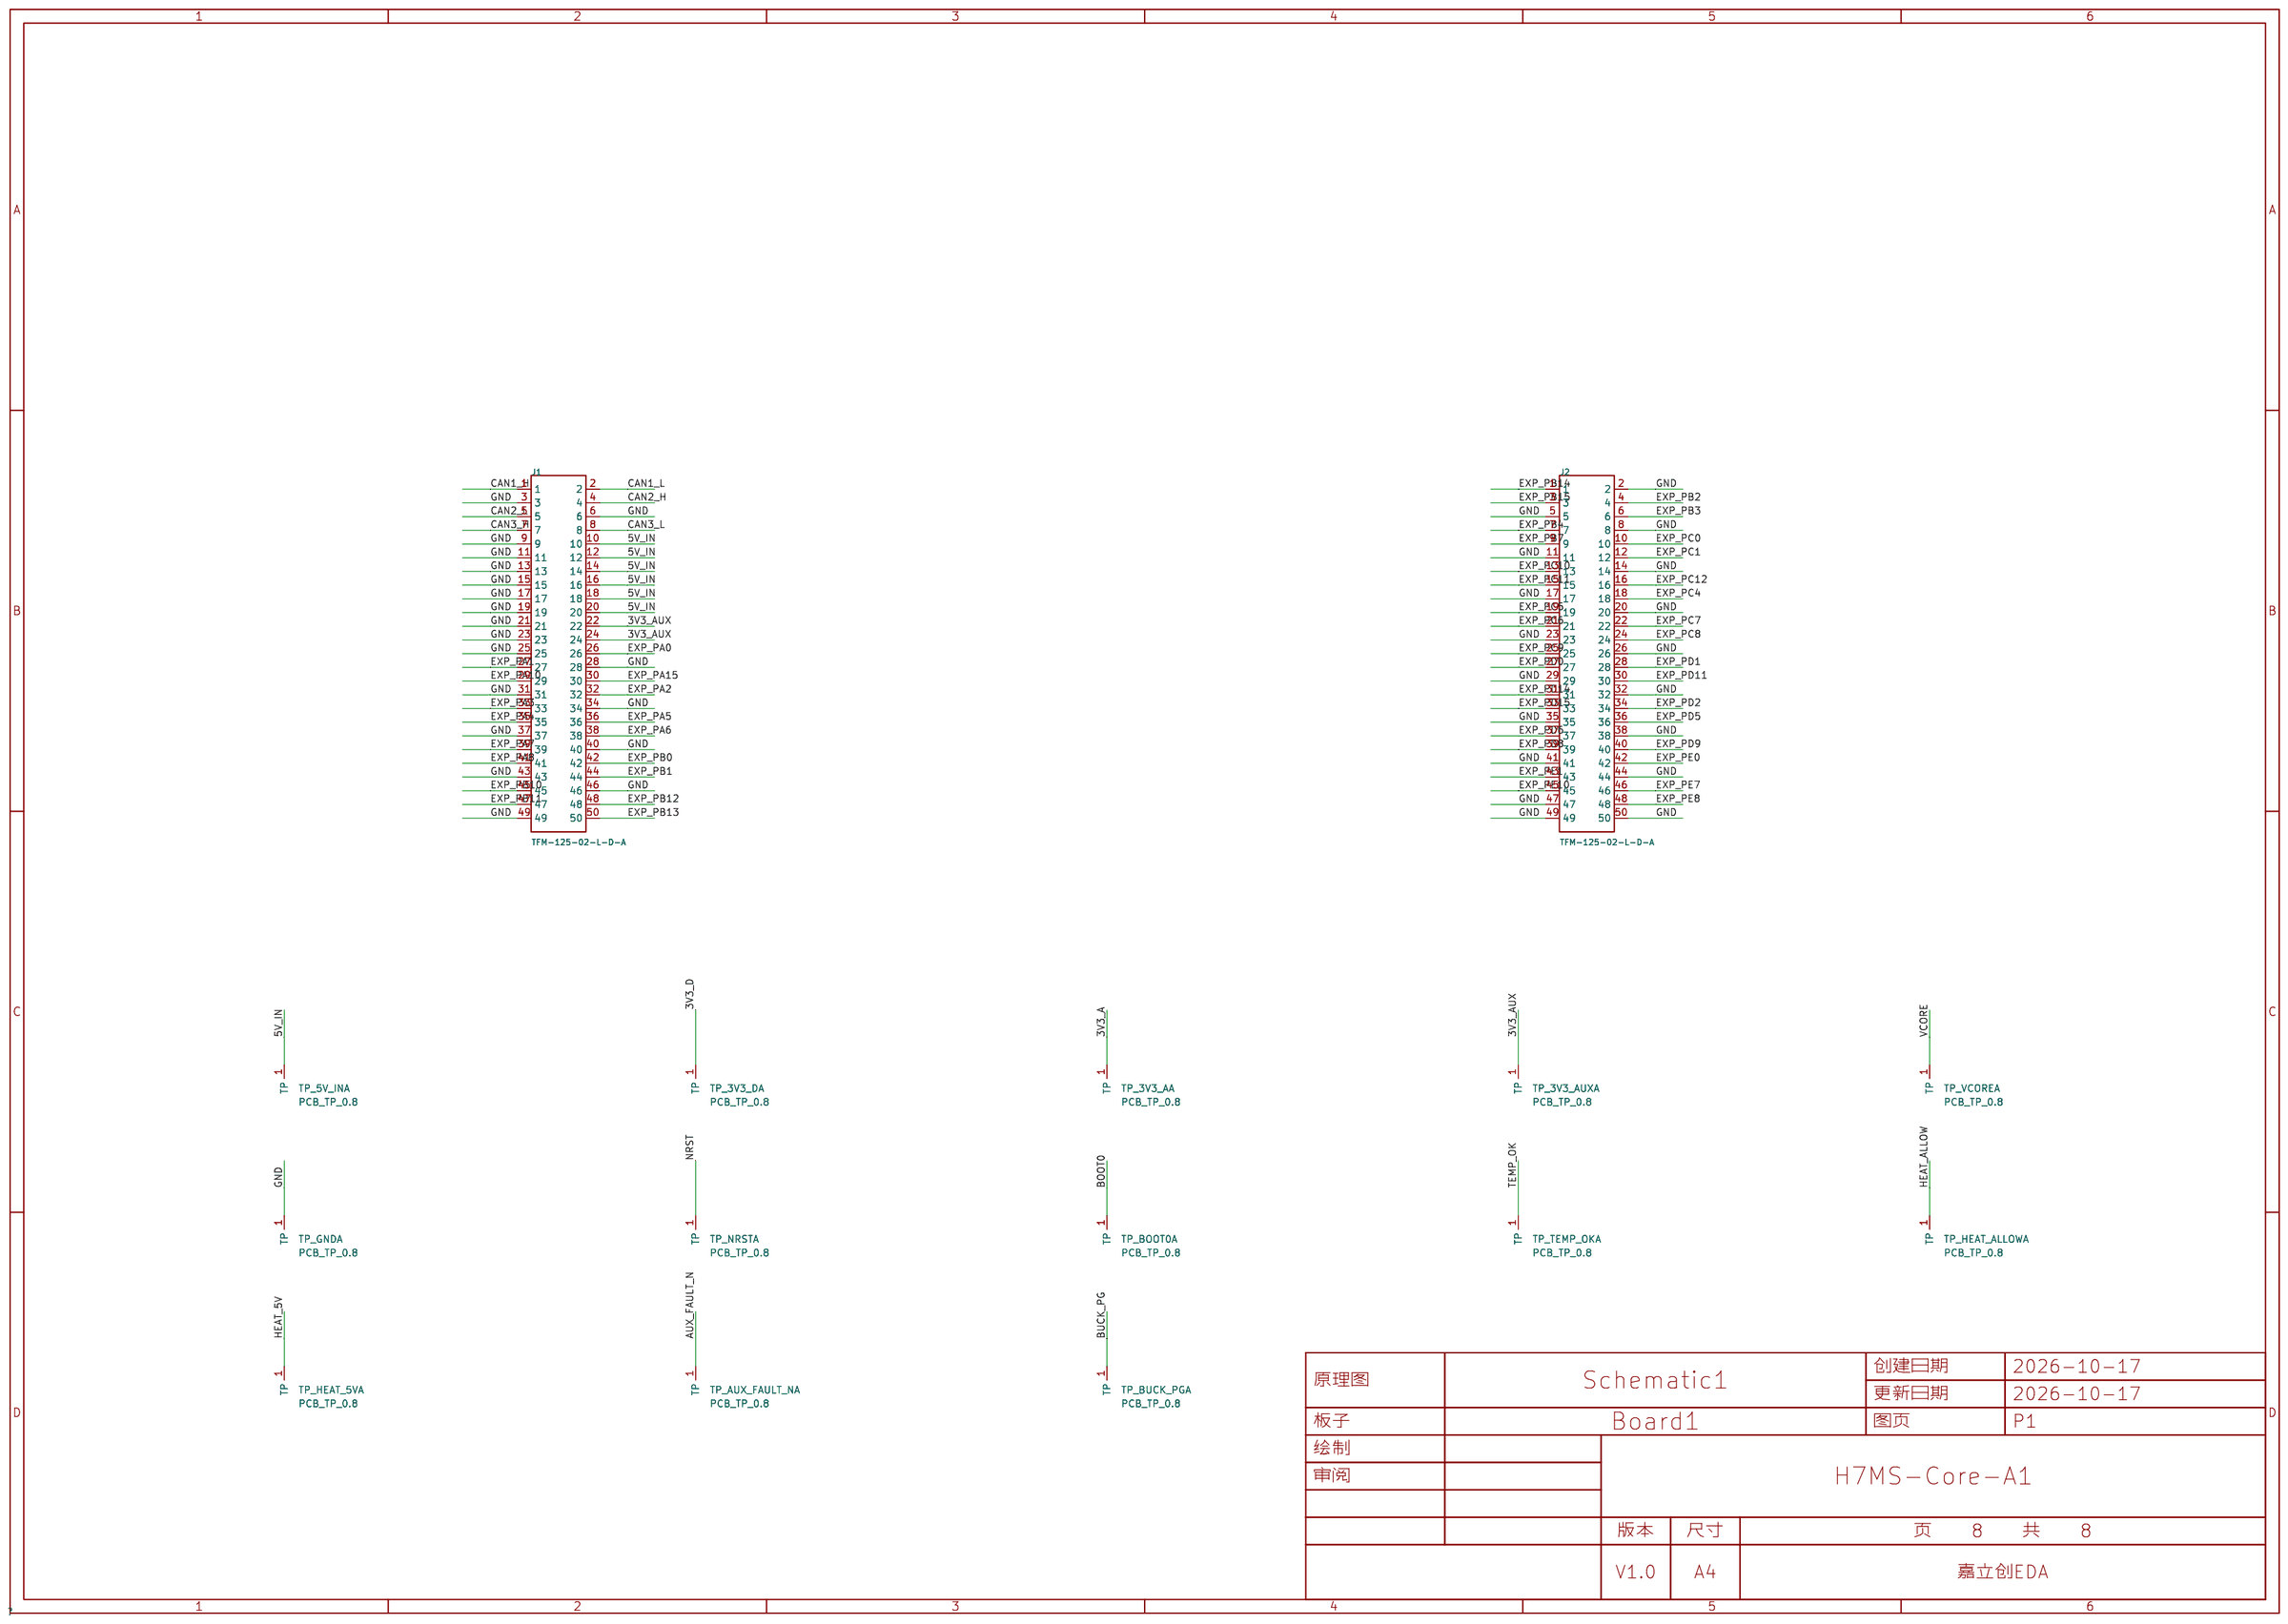
[diagram p7: C07_板间连接器与测试点]

## Parts
sheet C01A_H735主控与信号分配
U1  STM32H735VGH6  [BGA-100_L8.0-W8.0-P0.80-R10-C10-BL]
sheet C01B_主控SMPS与电源去耦
C_SMPS_HF  100nF  [C0402]
C_SMPS_IN  10uF  [C0805]
C_SMPS_SW  220pF  [C0603]
C_USB_BULK  1uF  [C0603]
C_USB_HF  100nF  [C0402]
C_VBAT_BULK  1uF  [C0603]
C_VBAT_HF  100nF  [C0402]
C_VCAP_D8  100nF  [C0402]
C_VCAP_G6  100nF  [C0402]
C_VCORE1  10uF  [C0805]
C_VCORE2  10uF  [C0805]
C_VDD_BULK  10uF  [C0805]
C_VDD_D6  100nF  [C0402]
C_VDD_E5  100nF  [C0402]
C_VDD_F6  100nF  [C0402]
C_VDDA_BULK  1uF  [C0603]
C_VDDA_HF  100nF  [C0402]
C_VREF_BULK  1uF  [C0603]
C_VREF_HF  100nF  [C0402]
L1  2.2uH  [IND-SMD_L2.5-W2.0-1]
R_ANALOG  0Ω  [R0805]
sheet C02_3V3降压与扩展电源保护
C_AUX_IN  1uF  [C0603]
C_AUX_IN_HF  100nF  [C0402]
C_AUX_OUT  10uF  [C0805]
C_AUX_OUT_HF  100nF  [C0402]
C_BUCK_HF  100nF  [C0402]
C_BUCK_IN  10uF  [C0805]
C_BUCK_IN2  10uF  [C0805]
C_BUCK_IN3  10uF  [C0805]
C_BUCK_OUT  10uF  [C0805]
C_BUCK_OUT2  10uF  [C0805]
C_BUCK_OUT3  10uF  [C0805]
C_BUCK_OUT4  10uF  [C0805]
C_BUCK_SS  10nF  [C0603]
L2  2.2uH  [IND-SMD_L4.0-W4.0_XAL4030-332MEC]
R_AUX_EN  10kΩ  [R0402]
R_AUX_FAULT  10kΩ  [R0402]
R_AUX_ILIM  45.3kΩ  [R0402]
R_BUCK_PG  100kΩ  [R0402]
R_FB_BOT  100kΩ  [R0603]
R_FB_TOP  312kΩ  [R0603]
SW_AUX_RESET  EVQP7A01P  [SW-SMD_EVQP7A01P]
U2  TPS62130ARGTR  [VQFN-16_L3.0-W3.0-P0.50-BL-EP1.7]
U_AUX  TPS2553DBVR-1  [SOT-23-6_L2.9-W1.6-P0.95-LS2.8-BL]
sheet C03_时钟复位启动与SWD
C_HSE  100nF  [C0402]
C_NRST  100nF  [C0402]
C_RESET_U  100nF  [C0402]
J_SWD  FTSH-105-01-L-DV-007-K  [HDR-SMD_9P-P1.27_FTSH-105-01-L-DV-007-K]
R_BOOT  10kΩ  [R0402]
R_HSE  22Ω  [R0402]
R_MR  10kΩ  [R0402]
R_NRST  10kΩ  [R0402]
SW_BOOT  EVQP7A01P  [SW-SMD_EVQP7A01P]
SW_RESET  EVQP7A01P  [SW-SMD_EVQP7A01P]
U_RESET  TPS3808G33DBVR  [SOT-23-6_L2.9-W1.6-P0.95-LS2.8-BR]
Y1  X1G0041710015  [OSC-SMD_4P-L2.5-W2.0-BL]
sheet C04_BMI088与加热安全控制
C_IMU_BULK  1uF  [C0603]
C_IMU_VDD  100nF  [C0402]
C_IMU_VDDIO  100nF  [C0402]
C_NTC  10nF  [C0603]
C_TEMP  100nF  [C0402]
C_U_HEAT_GATE  100nF  [C0402]
C_U_HEAT_POWER_IN  1uF  [C0603]
C_U_HEAT_POWER_OUT  100nF  [C0402]
C_V5  10nF  [C0603]
NTC1  NTCG163JF103FT1  [R0603]
Q_HEAT  DMN2056U-7  [SOT-23-3_L2.9-W1.6-P1.90-LS2.8-BR]
R_HEAT1  200Ω  [R1206]
R_HEAT2  200Ω  [R1206]
R_HEAT3  200Ω  [R1206]
R_HEAT4  200Ω  [R1206]
R_HEAT_ALLOW  100kΩ  [R0402]
R_HEAT_G  100Ω  [R0402]
R_HEAT_G_PD  100kΩ  [R0402]
R_IMU_ACC_CS  10kΩ  [R0402]
R_IMU_GYRO_CS  10kΩ  [R0402]
R_IMU_MOSI  22Ω  [R0402]
R_IMU_POWER  0Ω  [R0805]
R_IMU_SCK  22Ω  [R0402]
R_NTC_ADC  1kΩ  [R0402]
R_NTC_TOP  10kΩ  [R0603]
R_TEMP  10kΩ  [R0402]
R_U_HEAT_POWER_QOD  1kΩ  [R0402]
R_V5_ADC  1kΩ  [R0402]
R_V5_BOT  10kΩ  [R0603]
R_V5_TOP  20kΩ  [R0603]
U_HEAT_GATE  SN74LVC1G08DBVR  [SOT-23-5_L3.0-W1.7-P0.95-LS2.8-BR]
U_HEAT_POWER  TPS22919DCKR  [SC-70-6_L2.2-W1.3-P0.65-LS2.1-BR]
U_IMU  BMI088  [LGA-16_L4.5-W3.0-P0.50-BL]
U_TEMP  TMP302ADRLR  [SOT-5X3-6_W1.6-L1.2-P0.50-LS1.6-BL]
sheet C05_CAN三路收发与保护
C_CAN1_VCC  100nF  [C0402]
C_CAN1_VIO  100nF  [C0402]
C_CAN2_VCC  100nF  [C0402]
C_CAN2_VIO  100nF  [C0402]
C_CAN3_VCC  100nF  [C0402]
C_CAN3_VIO  100nF  [C0402]
C_CAN_BULK  10uF  [C0805]
D_CAN1  PESD2CANFD24V-TR  [SOT-23-3_L2.9-W1.3-P1.90-LS2.4-BR]
D_CAN2  PESD2CANFD24V-TR  [SOT-23-3_L2.9-W1.3-P1.90-LS2.4-BR]
D_CAN3  PESD2CANFD24V-TR  [SOT-23-3_L2.9-W1.3-P1.90-LS2.4-BR]
R_CAN1_STB  10kΩ  [R0402]
R_CAN1_TX  10kΩ  [R0402]
R_CAN2_STB  10kΩ  [R0402]
R_CAN2_TX  10kΩ  [R0402]
R_CAN3_STB  10kΩ  [R0402]
R_CAN3_TX  10kΩ  [R0402]
U_CAN1  TCAN1042HGVDRBRQ1  [HVSON-8_L3.0-W3.0-P0.65-BL-EP]  (section 1)
U_CAN2  TCAN1042HGVDRBRQ1  [HVSON-8_L3.0-W3.0-P0.65-BL-EP]  (section 1)
U_CAN3  TCAN1042HGVDRBRQ1  [HVSON-8_L3.0-W3.0-P0.65-BL-EP]  (section 1)
sheet C06_USB设备接口与VBUS检测
C_USB_VBUS  100nF  [C0402]
C_VBUS_U  100nF  [C0402]
J_USB  USB4105-GF-A-120  [USB-C-SMD_MC-311D]
R_CC1  5.1kΩ  [R0402]
R_CC2  5.1kΩ  [R0402]
R_USB_DM  0Ω  [R0402]
R_USB_DP  0Ω  [R0402]
R_USB_SHELL  0Ω  [R0402]
R_VBUS_PD  100kΩ  [R0402]
R_VBUS_SER  1kΩ  [R0402]
U_USB_ESD  USBLC6-2SC6  [SOT-23-6_L2.9-W1.6-P0.95-LS2.8-BL]
U_VBUS  SN74LVC1G17DBVR  [SOT-23-5_L3.0-W1.7-P0.95-LS2.8-BR]
sheet C07_板间连接器与测试点
J1  TFM-125-02-L-D-A  [CONN-SMD_50P-P1.27_TFM-125-02-L-D-A]
J2  TFM-125-02-L-D-A  [CONN-SMD_50P-P1.27_TFM-125-02-L-D-A]
TP_3V3_A  PCB_TP_0.8  [H7MS_TP_0p8_NOMASKPASTE]  (section 1)  (no BOM)
TP_3V3_AUX  PCB_TP_0.8  [H7MS_TP_0p8_NOMASKPASTE]  (section 1)  (no BOM)
TP_3V3_D  PCB_TP_0.8  [H7MS_TP_0p8_NOMASKPASTE]  (section 1)  (no BOM)
TP_5V_IN  PCB_TP_0.8  [H7MS_TP_0p8_NOMASKPASTE]  (section 1)  (no BOM)
TP_AUX_FAULT_N  PCB_TP_0.8  [H7MS_TP_0p8_NOMASKPASTE]  (section 1)  (no BOM)
TP_BOOT0  PCB_TP_0.8  [H7MS_TP_0p8_NOMASKPASTE]  (section 1)  (no BOM)
TP_BUCK_PG  PCB_TP_0.8  [H7MS_TP_0p8_NOMASKPASTE]  (section 1)  (no BOM)
TP_GND  PCB_TP_0.8  [H7MS_TP_0p8_NOMASKPASTE]  (section 1)  (no BOM)
TP_HEAT_5V  PCB_TP_0.8  [H7MS_TP_0p8_NOMASKPASTE]  (section 1)  (no BOM)
TP_HEAT_ALLOW  PCB_TP_0.8  [H7MS_TP_0p8_NOMASKPASTE]  (section 1)  (no BOM)
TP_NRST  PCB_TP_0.8  [H7MS_TP_0p8_NOMASKPASTE]  (section 1)  (no BOM)
TP_TEMP_OK  PCB_TP_0.8  [H7MS_TP_0p8_NOMASKPASTE]  (section 1)  (no BOM)
TP_VCORE  PCB_TP_0.8  [H7MS_TP_0p8_NOMASKPASTE]  (section 1)  (no BOM)

## Library data of the parts
U1 = STM32H735VGH6: CPU内核:ARM Cortex-M7;CPU最大主频:550MHz;CPU位数:32 Bit;; LCSC Part Name: 高性能和带 DP-FPU 的 DSP、配备 1 MByte 闪存和 564 KBytes RAM 的 Arm Cortex-M7 微控制器、550 MHz CPU、L1 缓存、外部内存接口、SMPS、包括加密加速器在内的外围设备子集; Supplier Part: C5271179; Manufacturer: ST(意法半导体); Supplier Footprint: TFBGA-100(8x8); JLCPCB Part Class: Extended Part; Datasheet: https://item.szlcsc.com/datasheet/STM32H735VGH6/5997904.html; Supplier: LCSC; CPU Core: ARM Cortex-M7; CPU Maximum Speed: 550MHz; Core Size: 32 Bit; Program Storage Size: 1MB; Program Memory Type: FLASH; RAM Size: 560KB; Number of I/O: 74; Oscillator Type: 内置+外置; Voltage - Supply: 1.62V~3.6V; Operating Temperature: -40℃~+85℃
C_AUX_IN_HF C_AUX_OUT_HF C_BUCK_HF C_CAN1_VCC C_CAN1_VIO C_CAN2_VCC C_CAN2_VIO C_CAN3_VCC C_CAN3_VIO C_HSE C_IMU_VDD C_IMU_VDDIO C_NRST C_RESET_U C_SMPS_HF C_TEMP C_U_HEAT_GATE C_U_HEAT_POWER_OUT C_USB_HF C_USB_VBUS C_VBAT_HF C_VBUS_U C_VCAP_D8 C_VCAP_G6 C_VDD_D6 C_VDD_E5 C_VDD_F6 C_VDDA_HF C_VREF_HF = C1005X7R1H104K050BB: 容值:100nF;精度:±10%;额定电压:50V;温度系数:X7R;; LCSC Part Name: 100nF ±10% 50V; Supplier Part: C2181015; Manufacturer: TDK; Supplier Footprint: 0402; JLCPCB Part Class: Extended Part; Datasheet: https://item.szlcsc.com/datasheet/C1005X7R1H104K050BB/2273082.html; Supplier: LCSC; Tolerance: ±10%; Voltage Rating: 50V; Temperature Coefficient: X7R
C_AUX_OUT C_BUCK_IN C_BUCK_IN2 C_BUCK_IN3 C_BUCK_OUT C_BUCK_OUT2-C_BUCK_OUT4 C_CAN_BULK C_SMPS_IN C_VCORE1 C_VCORE2 C_VDD_BULK = GRM21BR61E106KA73L: 容值:10uF;精度:±10%;额定电压:25V;温度系数:X5R;; LCSC Part Name: 10uF ±10% 25V; Supplier Part: C84416; Manufacturer: muRata(村田); Supplier Footprint: 0805; JLCPCB Part Class: Extended Part; Datasheet: https://item.szlcsc.com/datasheet/GRM21BR61E106KA73L/85586.html; Supplier: LCSC; Tolerance: ±10%; Voltage Rating: 25V; Temperature Coefficient: X5R
C_SMPS_SW = C1608C0G1H221J080AA: 容值:220pF;精度:±5%;额定电压:50V;温度系数:C0G;; LCSC Part Name: 220pF ±5% 50V; Supplier Part: C3893887; Manufacturer: TDK; Supplier Footprint: 0603; JLCPCB Part Class: Extended Part; Datasheet: https://item.szlcsc.com/datasheet/C1608C0G1H221J080AA/4462415.html; Supplier: LCSC; Tolerance: ±5%; Voltage Rating: 50V; Temperature Coefficient: C0G
C_AUX_IN C_IMU_BULK C_U_HEAT_POWER_IN C_USB_BULK C_VBAT_BULK C_VDDA_BULK C_VREF_BULK = C1608X7R1C105K080AC: 容值:1uF;精度:±10%;额定电压:16V;温度系数:X7R;; LCSC Part Name: 1uF ±10% 16V; Supplier Part: C2167399; Manufacturer: TDK; Supplier Footprint: 0603; JLCPCB Part Class: Extended Part; Datasheet: https://item.szlcsc.com/datasheet/C1608X7R1C105K080AC/2259451.html; Supplier: LCSC; Tolerance: ±10%; Voltage Rating: 16V; Temperature Coefficient: X7R
L1 = VLS252012HBX-2R2M-1: 电感值:2.2uH;精度:±20%;额定电流:2.04A;饱和电流(Isat):2.04A;类型:-;; LCSC Part Name: 2.2uH ±20% 2.04A; Supplier Part: C88535; Manufacturer: TDK; Supplier Footprint: 1008; JLCPCB Part Class: Extended Part; Datasheet: https://atta.szlcsc.com/upload/public/pdf/source/20180629/C88535_D29F4F5330AC049E01BE88F05575ED20.pdf; Supplier: LCSC; Tolerance: ±20%; Rated Current: 2.04A; Saturation Current (Isat): 2.04A; DC Resistance (DCR): 102mΩ
R_ANALOG R_IMU_POWER = RC0805JR-070RL: 电阻类型:厚膜电阻;阻值:0Ω;精度:±5%;功率:125mW;工作电压:150V;温度系数:-;; LCSC Part Name: 厚膜电阻 0Ω ±5% 125mW; Supplier Part: C96345; Manufacturer: YAGEO(国巨); Supplier Footprint: 0805; JLCPCB Part Class: Extended Part; Datasheet: https://item.szlcsc.com/datasheet/RC0805JR-070RL/97549.html; Supplier: LCSC; Type: 厚膜电阻; Tolerance: ±5%; Power(Watts): 125mW; Voltage-Supply(Max): 150V; Operating Temperature: -55℃~+155℃
C_BUCK_SS C_NTC C_V5 = C1608C0G1H103J080AA: 容值:10nF;精度:±5%;额定电压:50V;材质(温度系数):C0G;; LCSC Part Name: 10nF ±5% 50V; Supplier Part: C2168383; Manufacturer: TDK; Supplier Footprint: 0603; JLCPCB Part Class: Extended Part; Datasheet: https://atta.szlcsc.com/upload/public/pdf/source/20210430/12912E3792F621391F28022904E5A4A4.pdf; Supplier: LCSC; Tolerance: ±5%; Voltage Rated: 50V; Temperature Coefficient: C0G
L2 = XFL4020-222MEC_C122469: 电感值:2.2uH;精度:±20%;额定电流:8A;饱和电流(Isat):3.7A;; LCSC Part Name: 2.2uH ±20% 3.7A; Supplier Part: C122469; Manufacturer: Coilcraft(线艺); Manufacturer Part: XFL4020-222MEC; Supplier Footprint: SMD,4x4mm; JLCPCB Part Class: Extended Part; Datasheet: https://www.coilcraft.com/getmedia/50632d43-da1b-4cdb-8ab4-3029cab51df3/xfl4020.pdf; Supplier: LCSC; Tolerance: ±20%; Current Rating: 8A; Current - Saturation(Isat): 3.7A; DC Resistance(DCR): 21.35mΩ
R_AUX_EN R_AUX_FAULT R_BOOT R_CAN1_STB R_CAN1_TX R_CAN2_STB R_CAN2_TX R_CAN3_STB R_CAN3_TX R_IMU_ACC_CS R_IMU_GYRO_CS R_MR R_NRST R_TEMP = RC0402FR-0710KL: 电阻类型:厚膜电阻;阻值:10kΩ;精度:±1%;功率:62.5mW;工作电压:50V;温度系数:±100ppm/℃;; LCSC Part Name: 厚膜电阻 10kΩ ±1% 62.5mW; Supplier Part: C60490; Manufacturer: YAGEO(国巨); Supplier Footprint: 0402; JLCPCB Part Class: Extended Part; Datasheet: https://item.szlcsc.com/datasheet/RC0402FR-0710KL/61542.html; Supplier: LCSC; Type: 厚膜电阻; Tolerance: ±1%; Power(Watts): 62.5mW; Voltage-Supply(Max): 50V; Temperature Coefficient: ±100ppm/℃; Operating Temperature: -55℃~+155℃
R_AUX_ILIM = RC0402FR-0745K3L: 电阻类型:厚膜电阻;阻值:45.3kΩ;精度:±1%;功率:62.5mW;工作电压:50V;温度系数:±100ppm/℃;; LCSC Part Name: 厚膜电阻 45.3kΩ ±1% 62.5mW; Supplier Part: C137977; Manufacturer: YAGEO(国巨); Supplier Footprint: 0402; JLCPCB Part Class: Extended Part; Datasheet: https://item.szlcsc.com/datasheet/RC0402FR-0745K3L/149293.html; Supplier: LCSC; Type: 厚膜电阻; Tolerance: ±1%; Power(Watts): 62.5mW; Voltage-Supply(Max): 50V; Temperature Coefficient: ±100ppm/℃; Operating Temperature: -55℃~+155℃
R_BUCK_PG R_HEAT_ALLOW R_HEAT_G_PD R_VBUS_PD = RC0402FR-07100KL: 电阻类型:厚膜电阻;阻值:100kΩ;精度:±1%;功率:62.5mW;工作电压:50V;温度系数:±100ppm/℃;; LCSC Part Name: 厚膜电阻 100kΩ ±1% 62.5mW; Supplier Part: C60491; Manufacturer: YAGEO(国巨); Supplier Footprint: 0402; JLCPCB Part Class: Extended Part; Datasheet: https://item.szlcsc.com/datasheet/RC0402FR-07100KL/61543.html; Supplier: LCSC; Type: 厚膜电阻; Tolerance: ±1%; Power(Watts): 62.5mW; Voltage-Supply(Max): 50V; Temperature Coefficient: ±100ppm/℃; Operating Temperature: -55℃~+155℃
R_FB_BOT = RT0603BRD07100KL: 电阻类型:薄膜电阻;阻值:100kΩ;精度:±0.1%;功率:100mW;最大工作电压:75V;温度系数:±25ppm/℃;; LCSC Part Name: 薄膜电阻 100kΩ ±0.1% 100mW; Supplier Part: C122538; Manufacturer: YAGEO(国巨); Supplier Footprint: 0603; JLCPCB Part Class: Extended Part; Datasheet: https://atta.szlcsc.com/upload/public/pdf/source/20170721/C122538_1500619326323834092.pdf; Supplier: LCSC; Type: 薄膜电阻; Tolerance: ±0.1%; Power(Watts): 100mW; Overload Voltage (Max): 75V; Temperature Coefficient: ±25ppm/℃; Operating Temperature Range: -55℃~+155℃
R_FB_TOP = RT0603BRD07312KL: 电阻类型:薄膜电阻;阻值:312kΩ;精度:±0.1%;功率:100mW;温度系数:±25ppm/℃;; LCSC Part Name: 薄膜电阻 312kΩ ±0.1% 100mW; Supplier Part: C861315; Manufacturer: YAGEO(国巨); Supplier Footprint: 0603; JLCPCB Part Class: Extended Part; Datasheet: https://item.szlcsc.com/datasheet/RT0603BRD07312KL/921653.html; Supplier: LCSC; Type: 薄膜电阻; Tolerance: ±0.1%; Power(Watts): 100mW; Temperature Coefficient: ±25ppm/℃; Operating Temperature: -55℃~+155℃
SW_AUX_RESET SW_BOOT SW_RESET = EVQP7A01P: 电路结构:单刀单掷;按钮形状:矩形按钮;作用力:2.2N;安装方式:卧贴;开关长度:3.5mm;开关宽度:3.55mm;开关高度:1.35mm;触点电流:50mA;额定电压:12V;带灯:-;工作寿命:10万次;; LCSC Part Name: 3.5*3.55*1.35mm 卧贴 轻触开关; Supplier Part: C79167; Manufacturer: PANASONIC(松下); Supplier Footprint: SMD,3.5x3.6mm; JLCPCB Part Class: Extended Part; Datasheet: https://item.szlcsc.com/datasheet/EVQP7A01P/80304.html; Supplier: LCSC; Circuit: 单刀单掷; Actuator Style: 矩形按钮; Operating Force: 2.2N; Mounting Type: 卧贴; Length: 3.5mm; Width: 3.55mm; Switch Height: 1.35mm; Contact Current: 50mA; Voltage Rating: 12V; Termination Style: 焊片; Life: 10万次; Operating Temperature: -20℃~+70℃
U2 = TPS62130ARGTR: 功能类型:降压型;工作电压:3V~17V;输出电压:900mV~6V;输出电流:3A;输出类型:可调;; LCSC Part Name: 降压型 3A 3V~17V; Supplier Part: C337502; Manufacturer: TI(德州仪器); Supplier Footprint: QFN-16-EP(3x3); JLCPCB Part Class: Extended Part; Datasheet: https://www.ti.com/cn/lit/ds/symlink/tps62132.pdf; Supplier: LCSC; Function: 降压型; Voltage - Supply: 3V~17V; Output Voltage: 900mV~6V; Output Current: 3A; Frequency - Switching: 2.5MHz; Operating Temperature: -40℃~+85℃@(TA); Synchronous Rectifier: 是; Number of Outputs: 1; Topology: 降压式; Quiescent Current: 17uA; Switch tube (built-in/external): 内置; Output Type: 可调; Features: 轻载高效模式；可调软启动；过流保护；输出电压跟随；工作状态指示
U_AUX = TPS2553DBVR-1: 类型:高侧开关;通道数:1;输入控制逻辑:高电平有效;工作电压:2.5V~6.5V;最大连续电流:1.5A;导通电阻:85mΩ;; LCSC Part Name: 精密可调、带电流限制的电源分配开关; Supplier Part: C111738; Manufacturer: TI(德州仪器); Supplier Footprint: SOT-23-6; JLCPCB Part Class: Extended Part; Datasheet: https://www.ti.com/cn/lit/ds/symlink/tps2553-1.pdf; Supplier: LCSC; Type: 高侧开关; Number of Channels: 1; Control Input Logic: 高电平有效; Voltage - Supply: 2.5V~6.5V; Maximum Continuous Current: 1.5A; RDS(on): 85mΩ; Features: 过温保护；过流保护；短路保护；过压保护；集成电荷泵；反向电压保护；反向电流阻断；软启动；锁存保护；欠压锁定; Operating Temperature	-: -40℃~+150℃
J_SWD = FTSH-105-01-L-DV-007-K: 插针结构:2x5P;间距:1.27mm;圆针/方针:方针;安装方式:立贴;排数:双排;总PIN位数:10P;额定电流:3.4A;配合针长度:3.05mm;端接针长度:-;触头材质:磷青铜;触头镀层:金;工作温度:-55℃~+125℃;颜色:黑色;; LCSC Part Name: 2x5P 间距:1.27mm 方针 立贴; Supplier Part: C5296739; Manufacturer: SAMTEC; Supplier Footprint: SMD,P=1.27mm; JLCPCB Part Class: Extended Part; Datasheet: https://item.szlcsc.com/datasheet/FTSH-105-01-L-DV-007-K/6042691.html; Supplier: LCSC; Pin Structure: 2x5P; Pitch: 1.27mm; Circluar Pins/Square Pins: 方针; Mounting Type: 立贴; Number of Rows: 双排; Number of Pins: 10P; Current Rating: 3.4A; Length of Mating Pin: 3.05mm; Contact Material: 磷青铜; Contact Plating: 金; Operating Temperature: -55℃~+125℃; Color: 黑色
R_HSE R_IMU_MOSI R_IMU_SCK = RC0402FR-0722RL: 电阻类型:厚膜电阻;阻值:22Ω;精度:±1%;功率:62.5mW;最大工作电压:50V;温度系数:±100ppm/℃;; LCSC Part Name: 厚膜电阻 22Ω ±1% 62.5mW; Supplier Part: C114765; Manufacturer: YAGEO(国巨); Supplier Footprint: 0402; JLCPCB Part Class: Extended Part; Datasheet: https://atta.szlcsc.com/upload/public/pdf/source/20180821/C275644_0D56F95EFF785E7D9A1FEF436B37DA78.pdf; Supplier: LCSC; Type: 厚膜电阻; Tolerance: ±1%; Power(Watts): 62.5mW; Overload Voltage (Max): 50V; Temperature Coefficient: ±100ppm/℃; Operating Temperature Range: -55℃~+155℃
U_RESET = TPS3808G33DBVR: 工作电压:1.7V~6.5V;复位有效电平:低电平有效;受监控电压数:1;复位超时:20ms;; LCSC Part Name: 低静态电流、可编程延迟监控电路; Supplier Part: C43698; Manufacturer: TI(德州仪器); Supplier Footprint: SOT-23-6; JLCPCB Part Class: Extended Part; Datasheet: https://www.ti.com/cn/lit/ds/symlink/tps3808.pdf; Supplier: LCSC; ChipType: 电压监控器; Output Type: 开漏; Voltage - Supply: 1.7V~6.5V; Reset Active Level: 低电平有效; Threshold Voltage: 3.07V; Number of Voltages Monitored: 1; Reset Timeout: 20ms; Operating Temperature: -40℃~+125℃; Function: 手动复位输入; Quiescent Current: 2.4uA
Y1 = X1G0041710015: 特性：标准频率：20种。 供电电压：1.8 V至3.3 V（典型值）。 功能：待机（ST）。 工作温度：-40℃至+105℃ 型号别名:SG-210STF 8.0000ML; LCSC Part Name: SG-210STF 8.000000MHz  1.6V~3.6V -40~+85℃; Supplier Part: C256004; Manufacturer: EPSON(爱普生); Supplier Footprint: SMD2520-4P; JLCPCB Part Class: Extended Part; Datasheet: https://item.szlcsc.com/datasheet/X1G0041710015/249769.html; Supplier: LCSC
NTC1 = NTCG163JF103FT1: 功率:100mW;阻值:10kΩ;电阻精度:±1%;B值精度:±1%;B值(25℃/50℃):3380K;最大稳态电流(25℃):310uA;; LCSC Part Name: 10kΩ 3380K 100mW; Supplier Part: C76589; Manufacturer: TDK; Supplier Footprint: 0603; JLCPCB Part Class: Extended Part; Datasheet: https://item.szlcsc.com/datasheet/NTCG163JF103FT1/77716.html; Supplier: LCSC; Power(Watts): 100mW; Resistance @ 25℃: 10kΩ; Resistance Tolerance: ±1%; B Constant Tolerance: ±1%; B Constant (25℃/50℃): 3380K; B Constant (25℃/75℃): 3422K; B Constant (25℃/85℃): 3435K; B Constant (25℃/100℃): 3453K; Steady State Current (Max): 310uA; Dissipation Factor: 1mW/℃; Operating Temperature: -40℃~+125℃; Length: 1.6mm; Width: 0.8mm; Height: 0.8mm
Q_HEAT = DMN2056U-7: 数量:1个N沟道;漏源电压(Vdss):20V;连续漏极电流(Id):4A;导通电阻(RDS(on)):45mΩ@2.5V;耗散功率(Pd):940mW;阈值电压(Vgs(th)):1V;; LCSC Part Name: 1个N沟道 耐压:20V 电流:4A; Supplier Part: C332302; Manufacturer: DIODES(美台); Supplier Footprint: SOT-23; JLCPCB Part Class: Extended Part; Datasheet: https://item.szlcsc.com/datasheet/DMN2056U-7/311108.html; Supplier: LCSC; Number: 1个N沟道; Drain to Source Voltage: 20V; Current - Continuous Drain(Id): 4A; RDS(on): 45mΩ@2.5V; Pd - Power Dissipation: 940mW; Gate Threshold Voltage (Vgs(th)): 1V; Gate Charge(Qg): 4.3nC@4.5V; Input Capacitance(Ciss): 339pF; Reverse Transfer Capacitance (Crss@Vds): 34pF; Operating Temperature: -55℃~+150℃; Type: N沟道; Output Capacitance(Coss): 47pF
R_HEAT1-R_HEAT4 = RC1206FR-07200RL: 电阻类型:厚膜电阻;阻值:200Ω;精度:±1%;功率:250mW;工作电压:200V;温度系数:±100ppm/℃;; LCSC Part Name: 厚膜电阻 200Ω ±1% 250mW; Supplier Part: C114939; Manufacturer: YAGEO(国巨); Supplier Footprint: 1206; JLCPCB Part Class: Extended Part; Datasheet: https://item.szlcsc.com/datasheet/RC1206FR-07200RL/116183.html; Supplier: LCSC; Type: 厚膜电阻; Tolerance: ±1%; Power(Watts): 250mW; Voltage-Supply(Max): 200V; Temperature Coefficient: ±100ppm/℃; Operating Temperature: -55℃~+155℃
R_HEAT_G = RC0402FR-07100RL: 电阻类型:厚膜电阻;阻值:100Ω;精度:±1%;功率:62.5mW;工作电压:50V;温度系数:±100ppm/℃;; LCSC Part Name: 厚膜电阻 100Ω ±1% 62.5mW; Supplier Part: C106232; Manufacturer: YAGEO(国巨); Supplier Footprint: 0402; JLCPCB Part Class: Extended Part; Datasheet: https://item.szlcsc.com/datasheet/RC0402FR-07100RL/107447.html; Supplier: LCSC; Type: 厚膜电阻; Tolerance: ±1%; Power(Watts): 62.5mW; Voltage-Supply(Max): 50V; Temperature Coefficient: ±100ppm/℃; Operating Temperature: -55℃~+155℃
R_NTC_ADC R_U_HEAT_POWER_QOD R_V5_ADC R_VBUS_SER = RC0402FR-071KL: 电阻类型:厚膜电阻;阻值:1kΩ;精度:±1%;功率:62.5mW;工作电压:50V;温度系数:±100ppm/℃;; LCSC Part Name: 厚膜电阻 1kΩ ±1% 62.5mW; Supplier Part: C106235; Manufacturer: YAGEO(国巨); Supplier Footprint: 0402; JLCPCB Part Class: Extended Part; Datasheet: https://item.szlcsc.com/datasheet/RC0402FR-071KL/107450.html; Supplier: LCSC; Type: 厚膜电阻; Tolerance: ±1%; Power(Watts): 62.5mW; Voltage-Supply(Max): 50V; Temperature Coefficient: ±100ppm/℃; Operating Temperature: -55℃~+155℃
R_NTC_TOP R_V5_BOT = RT0603BRD0710KL: 电阻类型:薄膜电阻;阻值:10kΩ;精度:±0.1%;功率:100mW;工作电压:75V;温度系数:±25ppm/℃;; LCSC Part Name: 薄膜电阻 10kΩ ±0.1% 100mW; Supplier Part: C95204; Manufacturer: YAGEO(国巨); Supplier Footprint: 0603; JLCPCB Part Class: Extended Part; Datasheet: https://item.szlcsc.com/datasheet/RT0603BRD0710KL/96405.html; Supplier: LCSC; Type: 薄膜电阻; Tolerance: ±0.1%; Power(Watts): 100mW; Voltage-Supply(Max): 75V; Temperature Coefficient: ±25ppm/℃; Operating Temperature: -55℃~+155℃
R_V5_TOP = RT0603BRD0720KL: 电阻类型:薄膜电阻;阻值:20kΩ;精度:±0.1%;功率:100mW;工作电压:75V;温度系数:±25ppm/℃;; LCSC Part Name: 薄膜电阻 20kΩ ±0.1% 100mW; Supplier Part: C723637; Manufacturer: YAGEO(国巨); Supplier Footprint: 0603; JLCPCB Part Class: Extended Part; Datasheet: https://item.szlcsc.com/datasheet/RT0603BRD0720KL/768328.html; Supplier: LCSC; Type: 薄膜电阻; Tolerance: ±0.1%; Power(Watts): 100mW; Voltage-Supply(Max): 75V; Temperature Coefficient: ±25ppm/℃; Operating Temperature: -55℃~+155℃
U_HEAT_GATE = SN74LVC1G08DBVR: 逻辑类型:与门;门电路数量:1;工作电压:1.65V~5.5V;静态电流(Iq):10uA;传播延迟(tpd):4ns@5V,50pF;; LCSC Part Name: 单路 2 输入正与门; Supplier Part: C7666; Manufacturer: TI(德州仪器); Supplier Footprint: SOT-23-5; JLCPCB Part Class: Extended Part; Datasheet: https://www.ti.com/cn/lit/ds/symlink/sn74lvc1g08.pdf; Supplier: LCSC; Logic Type: 与门; Number of Gates: 1; Voltage - Supply: 1.65V~5.5V; Quiescent Current: 10uA; Current - Output Low(IOL): 32mA; Current - Output High(IOH): 32mA; Input Logic Level - High: 2V；1.7V; Input Logic Level - Low: 800mV；700mV; Output Logic Level - High: 1.9V；2.3V；1.2V；3.8V; Output Logic Level - Low: 550mV；300mV；450mV; Series: 74LVC系列; Propagation Delay: 4ns@5V,50pF; Operating Temperature: -40℃~+125℃; Inputs per Gates: 2; Features: 局部关断模式；过压容忍输入；带电插入保护；后驱动保护
U_HEAT_POWER = TPS22919DCKR: 类型:负载开关;通道数:1;输入控制逻辑:高电平有效;工作电压:1.6V~5.5V;最大连续电流:1.5A;导通电阻:89mΩ;; LCSC Part Name: 具有受控上升时间的5.5V、1.5A、90mΩ自保护负载开关; Supplier Part: C2149796; Manufacturer: TI(德州仪器); Supplier Footprint: SC-70-6; JLCPCB Part Class: Extended Part; Datasheet: https://www.ti.com/cn/lit/ds/symlink/tps22919.pdf; Supplier: LCSC; Type: 负载开关; Number of Channels: 1; Control Input Logic: 高电平有效; Voltage - Supply: 1.6V~5.5V; Maximum Continuous Current: 1.5A; RDS(on): 89mΩ; Features: 短路保护；过流保护；输出放电功能；软启动；过温保护; Operating Temperature	-: -40℃~+125℃
U_IMU = BMI088: 传感器类型:IMU(加速度计+陀螺仪);接口类型:I2C；SPI;; Supplier Part: C194919; Manufacturer: Bosch(博世); Supplier Footprint: LGA-16(3x4.5); JLCPCB Part Class: Extended Part; Datasheet: https://item.szlcsc.com/datasheet/BMI088/239391.html; Supplier: LCSC; Accelerometer Sensing Axis: X,Y,Z; Acceleration Measurement Range (MAX): ±24g; Gyroscope Sensing Axis: X,Y,Z; Gyroscope Measurement Range (MAX): ±2000dps; Sensor Type: IMU(加速度计+陀螺仪); Output Bits: 16bit; Interface: I2C；SPI; Voltage - Supply: 2.4V~3.6V; Operating Temperature: -40℃~+85℃; Features: 运动事件检测；同步与时间戳
U_TEMP = TMP302ADRLR: 动作温度:65℃;; LCSC Part Name: 易于使用、低功耗、低电源温度、微封装温度开关; Supplier Part: C2877557; Manufacturer: TI(德州仪器); Supplier Footprint: SOT-563; JLCPCB Part Class: Extended Part; Datasheet: https://www.ti.com/cn/lit/ds/symlink/tmp302.pdf; Supplier: LCSC; Type: 半导体式; Number of Channels: 1; Operating Temperature: 65℃; Programmable Action Temperature Range: +50℃~+65℃; Temperature Hysteresis Configuration: 10℃；5℃; Accuracy of Operating Temperature: ±0.2℃; Voltage - Supply: 1.4V~3.6V; Current - Supply: 15uA; Quiescent Current: 15uA; Low Temperature (Cold) Detection: 不支持; Features: 可调滞回温度；可调温度阈值
D_CAN1-D_CAN3 = PESD2CANFD24V-TR: 极性:双向;反向截止电压(Vrwm):24V;钳位电压:42V;峰值脉冲电流(Ipp):2.6A@8/20us;峰值脉冲功率(Ppp):-;击穿电压(VBR):25.5V;; LCSC Part Name: 双向ESD 24V截止 峰值浪涌电流：2.6A@8/20us; Supplier Part: C552486; Manufacturer: Nexperia(安世); Supplier Footprint: SOT-23; JLCPCB Part Class: Extended Part; Datasheet: https://item.szlcsc.com/datasheet/PESD2CANFD24V-TR/573483.html; Supplier: LCSC; Polarity: 双向; Reverse Stand-Off Voltage (Vrwm): 24V; Clamping Voltage: 42V; Peak Pulse Current (Ipp): 2.6A@8/20us; Voltage - Breakdown: 25.5V; Reverse Leakage Current (Ir): 50nA; Operating Temperature: -55℃~+175℃; level of protection: IEC 61000-4-2; Type: ESD; Junction Capacitance: 6pF
U_CAN1-U_CAN3 = H7MS_TCAN1042HGVDRBRQ1: Pin 5 corrected to VIO per TI datasheet; Manufacturer: TI(德州仪器); Supplier: LCSC; Supplier Part: C2671243
J_USB = USB4105-GF-A-120: 连接器类型:Type-C;协议标准:USB 2.0;公母:母;安装方式:-;触点数量:16P;端口数量:1;额定电流 - 电源:5A;工作温度:-40℃~+85℃;; LCSC Part Name: Type-C 母; Supplier Part: C5184243; Manufacturer: GCT; Supplier Footprint: SMD; JLCPCB Part Class: Extended Part; Datasheet: https://item.szlcsc.com/datasheet/USB4105-GF-A-120/5849584.html; Supplier: LCSC; Connector Type: Type-C; Protocol Standard: USB 2.0; Gender: 母; Number of Contacts: 16P; Number of Ports: 1; Current Rating-Power: 5A; Voltage Rating: 48V; Detection color: 黑色; Operating Temperature: -40℃~+85℃
R_CC1 R_CC2 = RC0402FR-075K1L: 电阻类型:厚膜电阻;阻值:5.1kΩ;精度:±1%;功率:62.5mW;工作电压:50V;温度系数:±100ppm/℃;; LCSC Part Name: 厚膜电阻 5.1kΩ ±1% 62.5mW; Supplier Part: C105872; Manufacturer: YAGEO(国巨); Supplier Footprint: 0402; JLCPCB Part Class: Extended Part; Datasheet: https://item.szlcsc.com/datasheet/RC0402FR-075K1L/107087.html; Supplier: LCSC; Type: 厚膜电阻; Tolerance: ±1%; Power(Watts): 62.5mW; Voltage-Supply(Max): 50V; Temperature Coefficient: ±100ppm/℃; Operating Temperature: -55℃~+155℃
R_USB_DM R_USB_DP R_USB_SHELL = RC0402JR-070RL: 电阻类型:厚膜电阻;阻值:0Ω;精度:±5%;功率:62.5mW;工作电压:50V;温度系数:-;; LCSC Part Name: 厚膜电阻 0Ω ±5% 62.5mW; Supplier Part: C60485; Manufacturer: YAGEO(国巨); Supplier Footprint: 0402; JLCPCB Part Class: Extended Part; Datasheet: https://item.szlcsc.com/datasheet/RC0402JR-070RL/61537.html; Supplier: LCSC; Type: 厚膜电阻; Tolerance: ±5%; Power(Watts): 62.5mW; Voltage-Supply(Max): 50V; Operating Temperature: -55℃~+155℃
U_USB_ESD = USBLC6-2SC6_C7519: 极性:单向;反向截止电压(Vrwm):5.25V;钳位电压:17V;峰值脉冲电流(Ipp):5A;击穿电压(VBR):6V;; LCSC Part Name: 单向ESD 5.25V截止 峰值脉冲电流：5A; Supplier Part: C7519; Manufacturer: ST(意法半导体); Supplier Footprint: SOT-23-6L; JLCPCB Part Class: Extended Part; Datasheet: https://item.szlcsc.com/datasheet/USBLC6-2SC6/7996.html; Supplier: LCSC; Polarity: 单向; Reverse Stand-Off Voltage (Vrwm): 5.25V; Clamping Voltage: 17V; Peak Pulse Current (Ipp): 5A; Voltage - Breakdown: 6V; Reverse Leakage Current (Ir): 150nA; Number of Channels: 双路; Operating Temperature: -40℃~+125℃; level of protection: IEC 61000-4-2; Type: ESD; Junction Capacitance: 3.5pF
U_VBUS = SN74LVC1G17DBVR: 输入类型:施密特触发器;工作电压:1.65V~5.5V;元件数:1;每个元件位数:1;灌电流(IOL):32mA;拉电流(IOH):32mA;; LCSC Part Name: 单施密特触发器缓冲器; Supplier Part: C7836; Manufacturer: TI(德州仪器); Supplier Footprint: SOT-23-5; JLCPCB Part Class: Extended Part; Datasheet: https://www.ti.com/cn/lit/ds/symlink/sn74lvc1g17.pdf; Supplier: LCSC; Input type: 施密特触发器; output type: 推挽式; Voltage - Supply: 1.65V~5.5V; Number of Elements: 1; Number of Bits per Element: 1; Channel Type: 单向; Current - Output Low(IOL): 32mA; Current - Output High(IOH): 32mA; Logic Family: 74LVC; Operating Temperature: -40℃~+125℃; Quiescent Current: 10uA; Propagation Delay: 4.6ns@3.3V,15pF; Features: 掉电隔离；电平转换
J1 J2 = TFM-125-02-L-D-A: 插针结构:2x25P;间距:1.27mm;安装方式:立贴;总PIN数:50P;排数:2;每排PIN数:25;行距:1.27mm;额定电流:3.2A;触头材质:磷青铜;触头镀层:锡;工作温度:-55℃~+125℃;; LCSC Part Name: 2x25P 间距:1.27mm 立贴; Supplier Part: C17489091; Manufacturer: SAMTEC; Supplier Footprint: SMD,P=1.27mm; JLCPCB Part Class: Extended Part; Datasheet: https://item.szlcsc.com/datasheet/TFM-125-02-L-D-A/18618286.html; Supplier: LCSC; Pins Structure: 2x25P; Pitch: 1.27mm; Mounting Type: 立贴; Number of Pins: 50P; Number of Rows: 2; Number of PINs Per Row: 25; Row Spacing: 1.27mm; Current Rating: 3.2A; Contact Material: 磷青铜; Contact Plating: 锡; Operating Temperature: -55℃~+125℃; Voltage Rating: 250V; Plastic Material: LCP; Flame Retardant Rating: UL94V-0; Color: 黑色; Z-Height of the Board: 5.72mm; X-Length of Bottom Edge on Board (Spacing Line): 34.93mm; Y-Width of Bottom Edge on Board: 5.72mm
TP_3V3_A TP_3V3_AUX TP_3V3_D TP_5V_IN TP_AUX_FAULT_N TP_BOOT0 TP_BUCK_PG TP_GND TP_HEAT_5V TP_HEAT_ALLOW TP_NRST TP_TEMP_OK TP_VCORE = H7MS_PCB_TP_0.8: PCB copper feature, no purchased part

## Nets
3V3_A: C_VDDA_BULK.1 C_VDDA_HF.1 C_VREF_BULK.1 C_VREF_HF.1 R_ANALOG.2 R_NTC_TOP.1 TP_3V3_A.1(TP) U1.H1(VDDA) U1.J1(VREF+)
3V3_AUX: C_AUX_OUT.1 C_AUX_OUT_HF.1 J1.22 J1.24 TP_3V3_AUX.1(TP) U_AUX.6(OUT)
3V3_D: C_AUX_IN.1 C_AUX_IN_HF.1 C_BUCK_OUT.1 C_BUCK_OUT2.1 C_BUCK_OUT3.1 C_BUCK_OUT4.1 C_CAN1_VIO.1 C_CAN2_VIO.1 C_CAN3_VIO.1 C_HSE.1 C_RESET_U.1 C_SMPS_HF.1 C_SMPS_IN.1 C_TEMP.1 C_U_HEAT_GATE.1 C_USB_BULK.1 C_USB_HF.1 C_VBAT_BULK.1 C_VBAT_HF.1 C_VBUS_U.1 C_VDD_BULK.1 C_VDD_D6.1 C_VDD_E5.1 C_VDD_F6.1 J_SWD.1 L2.2 R_ANALOG.1 R_AUX_EN.2 R_AUX_FAULT.2 R_BUCK_PG.2 R_CAN1_STB.2 R_CAN1_TX.2 R_CAN2_STB.2 R_CAN2_TX.2 R_CAN3_STB.2 R_CAN3_TX.2 R_FB_TOP.1 R_IMU_POWER.1 R_MR.2 R_NRST.2 R_TEMP.2 SW_BOOT.2 SW_BOOT.2&apos; TP_3V3_D.1(TP) U1.C2(VBAT) U1.D3(PDR_ON) U1.D6(VDD) U1.E1(VDDSMPS) U1.E5(VDD) U1.E8(VDD33USB) U1.F6(VDD) U2.14(VOS) U_AUX.1(IN) U_CAN1.5(VIO) U_CAN2.5(VIO) U_CAN3.5(VIO) U_HEAT_GATE.5(VCC) U_RESET.5(SENSE) U_RESET.6(VDD) U_TEMP.4(HYSTSET) U_TEMP.5(VS) U_TEMP.6(TRIPSET1) U_VBUS.5(VCC) Y1.1(OE/NC) Y1.4(VDD)
3V3_IMU: C_IMU_BULK.1 C_IMU_VDD.1 C_IMU_VDDIO.1 R_IMU_ACC_CS.2 R_IMU_GYRO_CS.2 R_IMU_POWER.2 U_IMU.3(VDD) U_IMU.11(VDDIO)
5V_IN: C_BUCK_HF.1 C_BUCK_IN.1 C_BUCK_IN2.1 C_BUCK_IN3.1 C_CAN1_VCC.1 C_CAN2_VCC.1 C_CAN3_VCC.1 C_CAN_BULK.1 C_U_HEAT_POWER_IN.1 J1.10 J1.12 J1.14 J1.16 J1.18 J1.20 R_V5_TOP.1 TP_5V_IN.1(TP) U2.10(AVIN) U2.11(PVIN) U2.12(PVIN) U2.13(EN) U_CAN1.3(VCC) U_CAN2.3(VCC) U_CAN3.3(VCC) U_HEAT_POWER.1(IN)
GND: C_AUX_IN.2 C_AUX_IN_HF.2 C_AUX_OUT.2 C_AUX_OUT_HF.2 C_BUCK_HF.2 C_BUCK_IN.2 C_BUCK_IN2.2 C_BUCK_IN3.2 C_BUCK_OUT.2 C_BUCK_OUT2.2 C_BUCK_OUT3.2 C_BUCK_OUT4.2 C_BUCK_SS.2 C_CAN1_VCC.2 C_CAN1_VIO.2 C_CAN2_VCC.2 C_CAN2_VIO.2 C_CAN3_VCC.2 C_CAN3_VIO.2 C_CAN_BULK.2 C_HSE.2 C_IMU_BULK.2 C_IMU_VDD.2 C_IMU_VDDIO.2 C_NRST.2 C_NTC.2 C_RESET_U.2 C_SMPS_HF.2 C_SMPS_IN.2 C_SMPS_SW.2 C_TEMP.2 C_U_HEAT_GATE.2 C_U_HEAT_POWER_IN.2 C_U_HEAT_POWER_OUT.2 C_USB_BULK.2 C_USB_HF.2 C_USB_VBUS.2 C_V5.2 C_VBAT_BULK.2 C_VBAT_HF.2 C_VBUS_U.2 C_VCAP_D8.2 C_VCAP_G6.2 C_VCORE1.2 C_VCORE2.2 C_VDD_BULK.2 C_VDD_D6.2 C_VDD_E5.2 C_VDD_F6.2 C_VDDA_BULK.2 C_VDDA_HF.2 C_VREF_BULK.2 C_VREF_HF.2 D_CAN1.3 D_CAN2.3 D_CAN3.3 J1.3 J1.6 J1.9 J1.11 J1.13 J1.15 J1.17 J1.19 J1.21 J1.23 J1.25 J1.28 J1.31 J1.34 J1.37 J1.40 J1.43 J1.46 J1.49 J2.2 J2.5 J2.8 J2.11 J2.14 J2.17 J2.20 J2.23 J2.26 J2.29 J2.32 J2.35 J2.38 J2.41 J2.44 J2.47 J2.49 J2.50 J_SWD.3 J_SWD.5 J_SWD.9 J_USB.A1-B12(GND) J_USB.B1-A12(GND) NTC1.2 Q_HEAT.2(S) R_AUX_ILIM.2 R_BOOT.2 R_CC1.2 R_CC2.2 R_FB_BOT.2 R_HEAT_ALLOW.2 R_HEAT_G_PD.2 R_USB_SHELL.2 R_V5_BOT.2 R_VBUS_PD.2 SW_AUX_RESET.2 SW_AUX_RESET.2&apos; SW_RESET.2 SW_RESET.2&apos; TP_GND.1(TP) U1.C1(VSS) U1.D1(VSSSMPS) U1.D5(VSS) U1.E7(VSS) U1.F5(VSS) U1.H2(VSSA) U2.6(AGND) U2.7(FSW) U2.8(DEF) U2.15(PGND) U2.16(PGND) U2.17(PAD) U_AUX.2(GND) U_CAN1.2(GND) U_CAN1.9(EP) U_CAN2.2(GND) U_CAN2.9(EP) U_CAN3.2(GND) U_CAN3.9(EP) U_HEAT_GATE.3(GND) U_HEAT_POWER.2(GND) U_IMU.2(NC) U_IMU.4(GNDA) U_IMU.6(GNDIO) U_IMU.7(PS) U_RESET.2(GND) U_TEMP.1(TRIPSET0) U_TEMP.2(GND) U_USB_ESD.2 U_VBUS.3(GND) Y1.2(GND)
V5_NODE: R_V5_ADC.1 R_V5_BOT.1 R_V5_TOP.2
VBUS_PRESENT: U1.E9(PA9) U_VBUS.4(Y)
VBUS_SENSE: R_VBUS_PD.1 R_VBUS_SER.2 U_VBUS.2(A)
AUX_EN: R_AUX_EN.1 SW_AUX_RESET.1 SW_AUX_RESET.1&apos; U_AUX.3(EN)
AUX_FAULT_N: R_AUX_FAULT.1 TP_AUX_FAULT_N.1(TP) U_AUX.4(FAULT#)
AUX_ILIM: R_AUX_ILIM.1 U_AUX.5(ILIM)
BOOT0: R_BOOT.1 SW_BOOT.1 SW_BOOT.1&apos; TP_BOOT0.1(TP) U1.A5(BOOT0)
BUCK_FB: R_FB_BOT.1 R_FB_TOP.2 U2.5(FB)
BUCK_PG: R_BUCK_PG.1 TP_BUCK_PG.1(TP) U2.4(PG)
BUCK_SS: C_BUCK_SS.1 U2.9(SS/TR)
BUCK_SW: L2.1 U2.1(SW) U2.2(SW) U2.3(SW)
CAN1_H: D_CAN1.2 J1.1 U_CAN1.7(CANH)
CAN1_L: D_CAN1.1 J1.2 U_CAN1.6(CANL)
CAN1_RX: U1.A4(PB8) U_CAN1.4(RXD)
CAN1_STB: R_CAN1_STB.1 U1.A8(PD3) U_CAN1.8(STB)
CAN1_TX: R_CAN1_TX.1 U1.E3(PB9) U_CAN1.1(TXD)
CAN2_H: D_CAN2.2 J1.4 U_CAN2.7(CANH)
CAN2_L: D_CAN2.1 J1.5 U_CAN2.6(CANL)
CAN2_RX: U1.A6(PB5) U_CAN2.4(RXD)
CAN2_STB: R_CAN2_STB.1 U1.B7(PD4) U_CAN2.8(STB)
CAN2_TX: R_CAN2_TX.1 U1.D4(PB6) U_CAN2.1(TXD)
CAN3_H: D_CAN3.2 J1.7 U_CAN3.7(CANH)
CAN3_L: D_CAN3.1 J1.8 U_CAN3.6(CANL)
CAN3_RX: U1.H9(PD12) U_CAN3.4(RXD)
CAN3_STB: R_CAN3_STB.1 U1.C6(PD7) U_CAN3.8(STB)
CAN3_TX: R_CAN3_TX.1 U1.H10(PD13) U_CAN3.1(TXD)
EXP_PA0: J1.26 U1.G3(PA0)
EXP_PA1: J1.27 U1.J2(PA1)
EXP_PA2: J1.32 U1.H3(PA2)
EXP_PA3: J1.33 U1.G5(PA3)
EXP_PA4: J1.35 U1.K1(PA4)
EXP_PA5: J1.36 U1.K2(PA5)
EXP_PA6: J1.38 U1.J3(PA6)
EXP_PA7: J1.39 U1.K3(PA7)
EXP_PA8: J1.41 U1.F10(PA8)
EXP_PA10: J1.29 U1.E10(PA10)
EXP_PA15: J1.30 U1.C8(PA15)
EXP_PB0: J1.42 U1.K4(PB0)
EXP_PB1: J1.44 U1.K5(PB1)
EXP_PB2: J2.4 U1.J5(PB2)
EXP_PB3: J2.6 U1.B6(PB3)
EXP_PB4: J2.7 U1.C5(PB4)
EXP_PB7: J2.9 U1.B5(PB7)
EXP_PB10: J1.45 U1.K7(PB10)
EXP_PB11: J1.47 U1.J7(PB11)
EXP_PB12: J1.48 U1.K8(PB12)
EXP_PB13: J1.50 U1.J8(PB13)
EXP_PB14: J2.1 U1.K9(PB14)
EXP_PB15: J2.3 U1.K10(PB15)
EXP_PC0: J2.10 U1.F3(PC0)
EXP_PC1: J2.12 U1.F1(PC1)
EXP_PC4: J2.18 U1.H4(PC4)
EXP_PC5: J2.19 U1.J4(PC5)
EXP_PC6: J2.21 U1.F8(PC6)
EXP_PC7: J2.22 U1.G9(PC7)
EXP_PC8: J2.24 U1.G10(PC8)
EXP_PC9: J2.25 U1.F9(PC9)
EXP_PC10: J2.13 U1.B10(PC10)
EXP_PC11: J2.15 U1.B9(PC11)
EXP_PC12: J2.16 U1.A10(PC12)
EXP_PD0: J2.27 U1.C7(PD0)
EXP_PD1: J2.28 U1.B8(PD1)
EXP_PD2: J2.34 U1.A9(PD2)
EXP_PD5: J2.36 U1.D7(PD5)
EXP_PD6: J2.37 U1.A7(PD6)
EXP_PD8: J2.39 U1.J9(PD8)
EXP_PD9: J2.40 U1.H8(PD9)
EXP_PD11: J2.30 U1.H7(PD11)
EXP_PD14: J2.31 U1.G7(PD14)
EXP_PD15: J2.33 U1.G8(PD15)
EXP_PE0: J2.42 U1.B4(PE0)
EXP_PE1: J2.43 U1.C4(PE1)
EXP_PE7: J2.46 U1.H5(PE7)
EXP_PE8: J2.48 U1.J6(PE8)
EXP_PE10: J2.45 U1.H6(PE10)
HEAT_5V: C_U_HEAT_POWER_OUT.1 R_HEAT1.1 R_HEAT2.1 R_HEAT3.1 R_HEAT4.1 R_U_HEAT_POWER_QOD.2 TP_HEAT_5V.1(TP) U_HEAT_POWER.6(VOUT)
HEAT_ALLOW: R_HEAT_ALLOW.1 TP_HEAT_ALLOW.1(TP) U_HEAT_GATE.4(Y) U_HEAT_POWER.3(ON)
HEAT_DRAIN: Q_HEAT.3(D) R_HEAT1.2 R_HEAT2.2 R_HEAT3.2 R_HEAT4.2
HEAT_GATE: Q_HEAT.1(G) R_HEAT_G.2 R_HEAT_G_PD.1
HSE_IN: R_HSE.2 U1.G1(PH0-OSC_IN)
HSE_OUT: R_HSE.1 Y1.3(OUT)
HSE_RESERVED: U1.G2(PH1-OSC_OUT)
IMU_ACC_CS: R_IMU_ACC_CS.1 U1.B3(PE3) U_IMU.14(CSB1)
IMU_ACC_IRQ: U1.E4(PC13) U_IMU.16(INT1)
IMU_GYRO_CS: R_IMU_GYRO_CS.1 U1.C3(PE4) U_IMU.5(CSB2)
IMU_GYRO_IRQ: U1.J10(PD10) U_IMU.12(INT3)
IMU_HEATER_NTC: C_NTC.1 R_NTC_ADC.2 U1.G4(PC3_C)
IMU_HEATER_PWM: R_HEAT_G.1 U1.K6(PE9)
IMU_MISO: U1.A2(PE5) U_IMU.10(SDO2) U_IMU.15(SDO1)
IMU_MOSI: R_IMU_MOSI.1 U1.A1(PE6)
IMU_MOSI_DEV: R_IMU_MOSI.2 U_IMU.9(SDA/SDI)
IMU_SCK: R_IMU_SCK.1 U1.A3(PE2)
IMU_SCK_DEV: R_IMU_SCK.2 U_IMU.8(SCL/SCK)
LOCAL_5V_ADC: C_V5.1 R_V5_ADC.2 U1.F4(PC2_C)
LSE_IN: U1.B1(PC14-OSC32_IN)
LSE_OUT: U1.B2(PC15-OSC32_OUT)
MR_N: R_MR.1 SW_RESET.1 SW_RESET.1&apos; U_RESET.3(MR#)
NRST: C_NRST.1 J_SWD.10 R_NRST.1 TP_NRST.1(TP) U1.F2(NRST) U_HEAT_GATE.2(B) U_RESET.1(RESET#)
NTC_NODE: NTC1.1 R_NTC_ADC.1 R_NTC_TOP.2
SMPS_SW: C_SMPS_SW.1 L1.1 U1.D2(VLXSMPS)
SWCLK: J_SWD.4 U1.C9(PA14)
SWDIO: J_SWD.2 U1.C10(PA13)
TEMP_OK: R_TEMP.1 TP_TEMP_OK.1(TP) U_HEAT_GATE.1(A) U_TEMP.3(OUT)
U_HEAT_POWER_QOD: R_U_HEAT_POWER_QOD.1 U_HEAT_POWER.5(QOD)
USB_CC1: J_USB.A5(CC1) R_CC1.1
USB_CC2: J_USB.B5(CC2) R_CC2.1
USB_DM: R_USB_DM.2 U1.D10(PA11)
USB_DM_CONN: J_USB.A7(Dn1) J_USB.B7(Dn2) R_USB_DM.1 U_USB_ESD.3 U_USB_ESD.4
USB_DP: R_USB_DP.2 U1.D9(PA12)
USB_DP_CONN: J_USB.A6(Dp1) J_USB.B6(Dp2) R_USB_DP.1 U_USB_ESD.1 U_USB_ESD.6
USB_SHELL: J_USB.1(EH) J_USB.2(EH) J_USB.3(EH) J_USB.4(EH) R_USB_SHELL.1
USB_VBUS: C_USB_VBUS.1 J_USB.A4-B9(VBUS) J_USB.B4-A9(VBUS) R_VBUS_SER.1 U_USB_ESD.5
VCORE: C_VCAP_D8.1 C_VCAP_G6.1 C_VCORE1.1 C_VCORE2.1 L1.2 TP_VCORE.1(TP) U1.D8(VCAP) U1.E2(VFBSMPS) U1.E6(VDDLDO) U1.F7(VDDLDO) U1.G6(VCAP)

Not connected (* = marked no-connect by the designer): J_SWD 6* 8*; J_USB A8(SBU1)* B8(SBU2)*; U_HEAT_POWER 4(NC)*; U_IMU 1(INT2)* 13(INT4)*; U_RESET 4(CT)*; U_VBUS 1(N.C)*

# Board PCB1
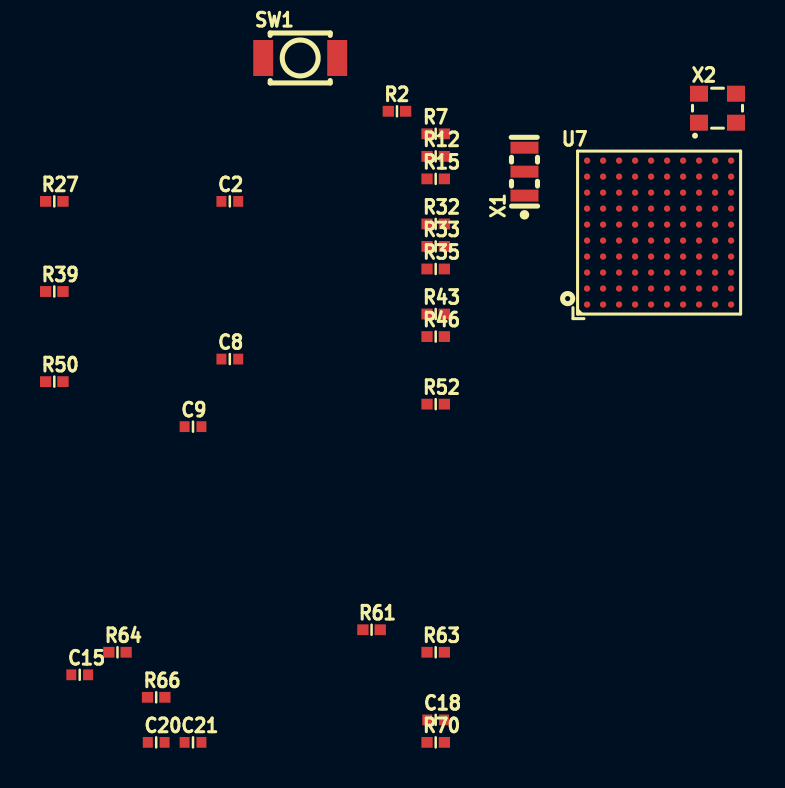
[diagram p8: board, top side]
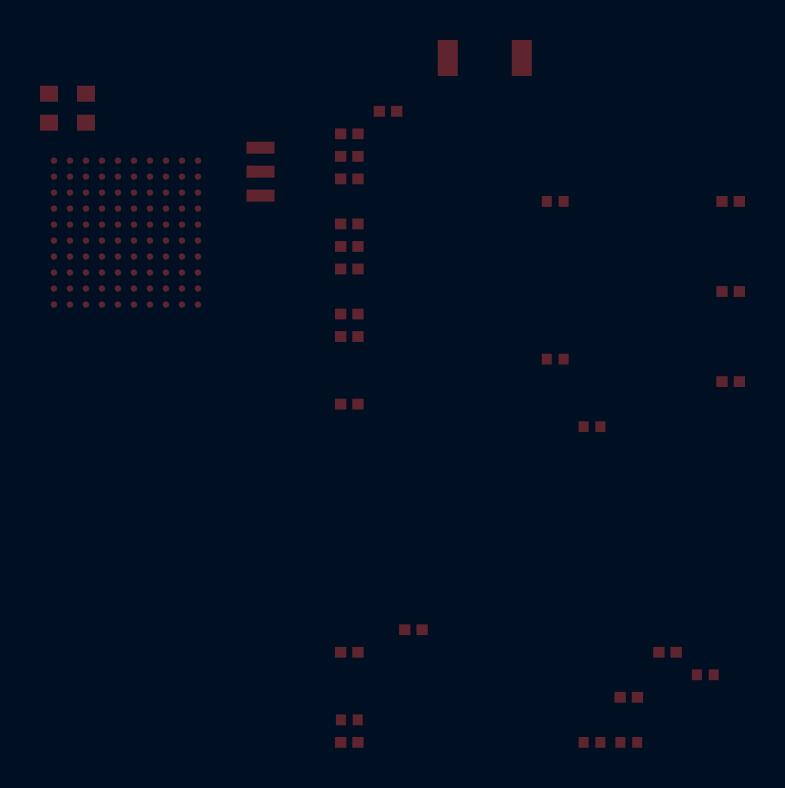
[diagram p9: board, bottom side, seen from below]

No outline. copper layers: Top Layer, Bottom Layer. Coordinates in mm from the lowest, leftmost part position.
Stack: Top Layer 0.035mm / Dielectric1 1.51mm FR4 er 4.5 / Bottom Layer 0.035mm

## Design rules (mm)
spacing copperThickness1oz (default): track to track 0.102, other pairs 0.152 to 0.3
spacing copperThickness2oz: track to track 0.203, other pairs 0.152 to 0.3
track width copperThickness1oz (default): min 0.127, default 0.254, max 2.54
track width copperThickness2oz: min 0.203, default 0.254, max 2.54
differential pair differentialPair (default): width min 0.127, default 0.254, max 2.54; gap min 0.152, default 0.152

## Placement (name value [footprint] x y rotation side)
C2  100nF  [C0402]  8.78 27.07 0 top
C8  100nF  [C0402]  8.78 19.18 0 top
C9  100nF  [C0402]  6.94 15.8 0 top
C15  2.2uF  [C0402]  1.27 3.38 0 top
C18  2.2uF  [C0402]  19.07 1.13 0 top
C20  100nF  [C0402]  5.09 0 0 top
C21  1uF  [C0402]  6.94 0 0 top
R2  10kΩ  [R0402]  17.13 31.57 0 top
R7  22Ω  [R0402]  19.07 30.45 0 top
R12  22Ω  [R0402]  19.07 29.32 0 top
R15  22Ω  [R0402]  19.07 28.19 0 top
R27  22Ω  [R0402]  0 27.07 0 top
R32  22Ω  [R0402]  19.07 25.94 0 top
R33  22Ω  [R0402]  19.07 24.81 0 top
R35  22Ω  [R0402]  19.07 23.68 0 top
R39  22Ω  [R0402]  0 22.56 0 top
R43  22Ω  [R0402]  19.07 21.43 0 top
R46  22Ω  [R0402]  19.07 20.3 0 top
R50  22Ω  [R0402]  0 18.05 0 top
R52  22Ω  [R0402]  19.07 16.92 0 top
R61  10kΩ  [R0402]  15.86 5.64 0 top
R63  22Ω  [R0402]  19.07 4.51 0 top
R64  22Ω  [R0402]  3.16 4.51 0 top
R66  10kΩ  [R0402]  5.09 2.25 0 top
R70  22Ω  [R0402]  19.07 0 0 top
SW1  HX TS253015A2P 160gf  [KEY-SMD_L3.0-W2.5-LS4.0_TD-1183SN]  12.29 34.24 0 top
U7  STM32H743VIH6  [BGA-100_L8.0-W8.0-P0.80-R10-C10-BL]  30.24 25.51 0 top
X1  8MHz  [OSC-SMD_3P-L3.2-W1.3-P1.20-L]  23.51 28.55 90 top
X2  8MHz  [OSC-SMD_4P-L2.5-W2.0-BL-1]  33.16 31.73 0 top

## Footprints (pads in the part's own frame, mm; a bottom-side part is the same pattern mirrored in y, then rotated)
BGA-100_L8.0-W8.0-P0.80-R10-C10-BL
  round 0.32 smd: A1(-3.6,-3.6) A2(-3.6,-2.8) A3(-3.6,-2) A4(-3.6,-1.2) A5(-3.6,-0.4) A6(-3.6,0.4) A7(-3.6,1.2) A8(-3.6,2) A9(-3.6,2.8) A10(-3.6,3.6) B1(-2.8,-3.6) B2(-2.8,-2.8) B3(-2.8,-2) B4(-2.8,-1.2) B5(-2.8,-0.4) B6(-2.8,0.4) B7(-2.8,1.2) B8(-2.8,2) B9(-2.8,2.8) B10(-2.8,3.6) C1(-2,-3.6) C2(-2,-2.8) C3(-2,-2) C4(-2,-1.2) C5(-2,-0.4) C6(-2,0.4) C7(-2,1.2) C8(-2,2) C9(-2,2.8) C10(-2,3.6) D1(-1.2,-3.6) D2(-1.2,-2.8) D3(-1.2,-2) D4(-1.2,-1.2) D5(-1.2,-0.4) D6(-1.2,0.4) D7(-1.2,1.2) D8(-1.2,2) D9(-1.2,2.8) D10(-1.2,3.6) E1(-0.4,-3.6) E2(-0.4,-2.8) E3(-0.4,-2) E4(-0.4,-1.2) E5(-0.4,-0.4) E6(-0.4,0.4) E7(-0.4,1.2) E8(-0.4,2) E9(-0.4,2.8) E10(-0.4,3.6) F1(0.4,-3.6) F2(0.4,-2.8) F3(0.4,-2) F4(0.4,-1.2) F5(0.4,-0.4) F6(0.4,0.4) F7(0.4,1.2) F8(0.4,2) F9(0.4,2.8) F10(0.4,3.6) G1(1.2,-3.6) G2(1.2,-2.8) G3(1.2,-2) G4(1.2,-1.2) G5(1.2,-0.4) G6(1.2,0.4) G7(1.2,1.2) G8(1.2,2) G9(1.2,2.8) G10(1.2,3.6) H1(2,-3.6) H2(2,-2.8) H3(2,-2) H4(2,-1.2) H5(2,-0.4) H6(2,0.4) H7(2,1.2) H8(2,2) H9(2,2.8) H10(2,3.6) J1(2.8,-3.6) J2(2.8,-2.8) J3(2.8,-2) J4(2.8,-1.2) J5(2.8,-0.4) J6(2.8,0.4) J7(2.8,1.2) J8(2.8,2) J9(2.8,2.8) J10(2.8,3.6) K1(3.6,-3.6) K2(3.6,-2.8) K3(3.6,-2) K4(3.6,-1.2) K5(3.6,-0.4) K6(3.6,0.4) K7(3.6,1.2) K8(3.6,2) K9(3.6,2.8) K10(3.6,3.6)
C0402
  rect 0.5x0.54 smd: 1(-0.42,0) 2(0.42,0)
KEY-SMD_L3.0-W2.5-LS4.0_TD-1183SN
  rect 1x1.8 smd: 1(-1.85,0) 2(1.85,0)
OSC-SMD_3P-L3.2-W1.3-P1.20-L
  rect 0.6x1.4 smd: 1(-1.199,0) 2(0,0) 3(1.199,0)
OSC-SMD_4P-L2.5-W2.0-BL-1
  rect 0.9x0.8 smd: 1(-0.925,-0.725) 2(0.925,-0.725) 3(0.925,0.725) 4(-0.925,0.725)
R0402
  rect 0.566x0.54 smd: 1(-0.433,0) 2(0.433,0)

## Nets
As in the schematic, except:
GND: C2.1 C8.1 C9.1 C15.1 C18.1 C20.1 C21.2 R2.1 X1.2
BOOT0: R2.2 SW1.2
MCU_3V3: C2.2 C8.2 C9.2 C20.2 C21.1 R61.2 R66.2 SW1.1

Pads without a net: C15 2; C18 2; R7 2; R12 2; R15 2; R27 1; R32 2; R33 2; R35 2; R39 1; R43 2; R46 2; R50 1; R52 2; R63 2; R70 2; U7 A1 A2 A3 A4 A5 A6 A7 A8 A9 A10 B1 B2 B3 B4 B5 B6 B7 B8 B9 B10 C1 C2 C3 C4 C5 C6 C7 C8 C9 C10 D1 D2 D3 D4 D5 D6 D7 D8 D9 D10 E1 E2 E3 E4 E5 E6 E7 E8 E9 E10 F1 F2 F3 F4 F5 F6 F7 F8 F9 F10 G1 G2 G3 G4 G5 G6 G7 G8 G9 G10 H1 H2 H3 H4 H5 H6 H7 H8 H9 H10 J1 J2 J3 J4 J5 J6 J7 J8 J9 J10 K1 K2 K3 K4 K5 K6 K7 K8 K9 K10; X2 1 2 3 4
